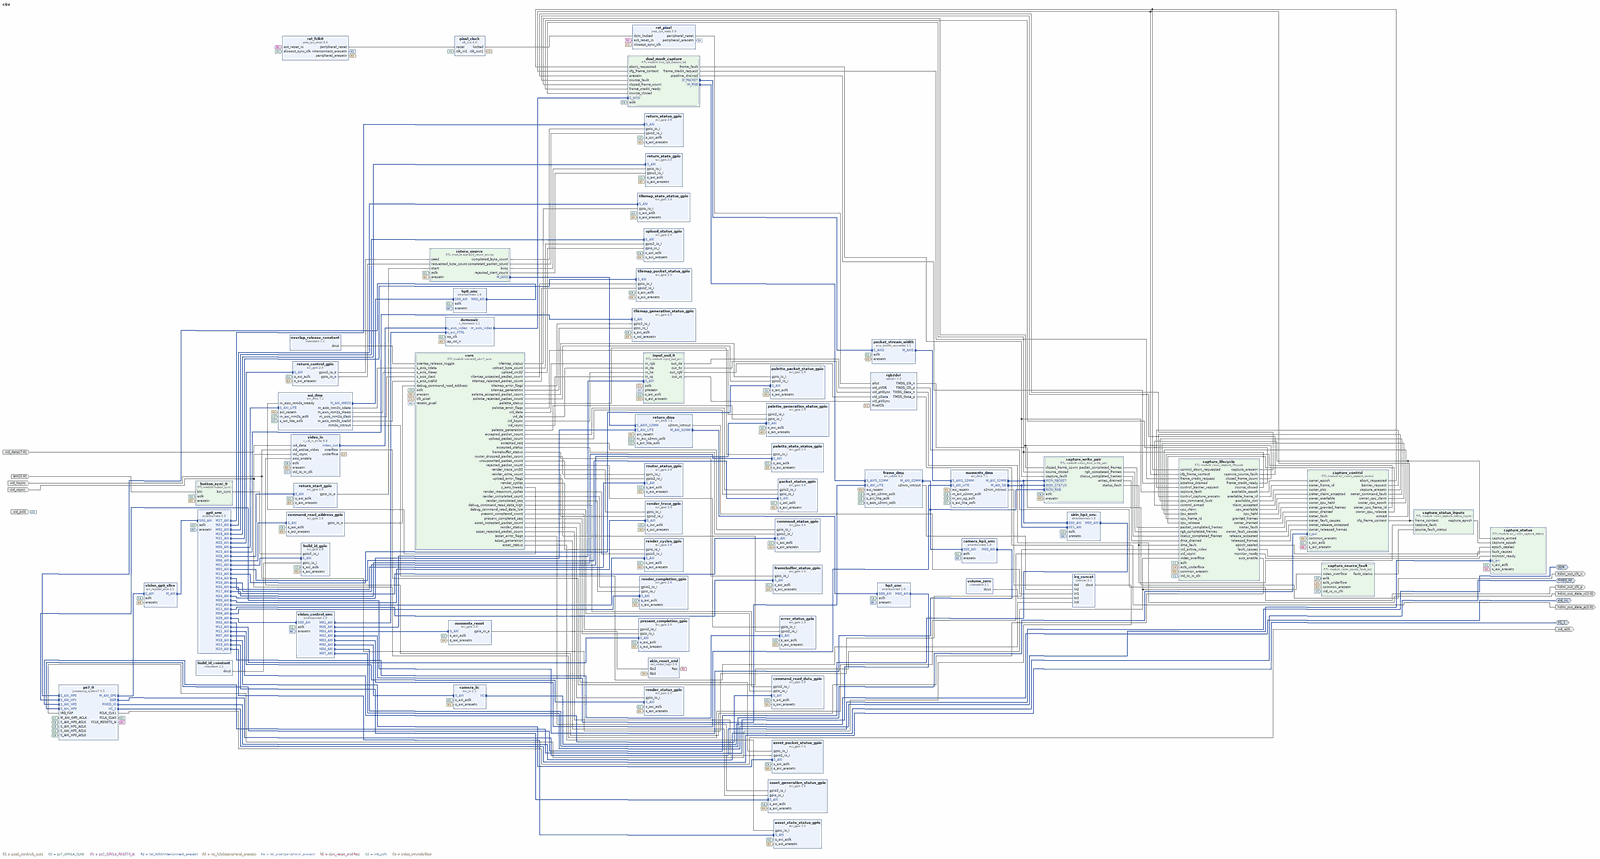
[diagram p0: block diagram of the top level, whole]
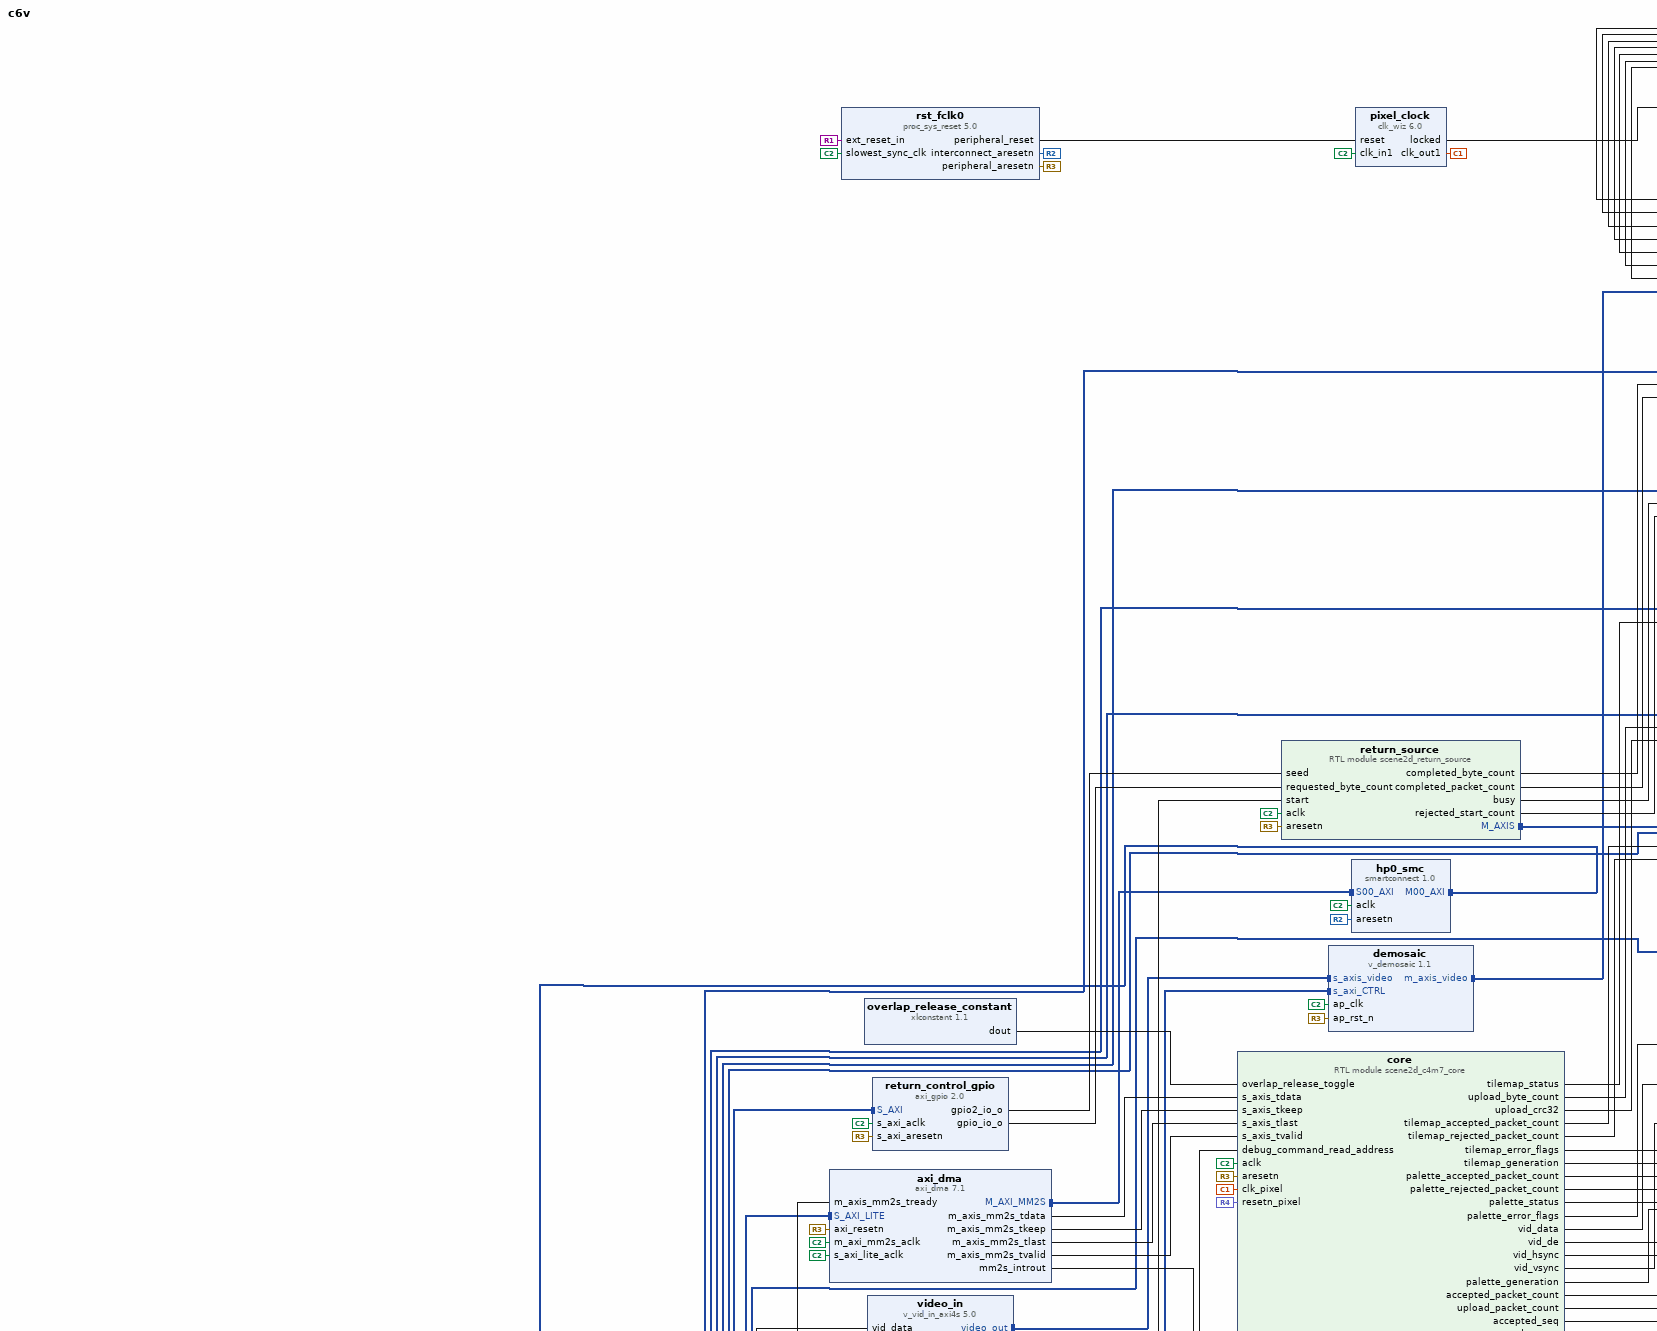
[diagram p1: block diagram of the top level, upper left part]
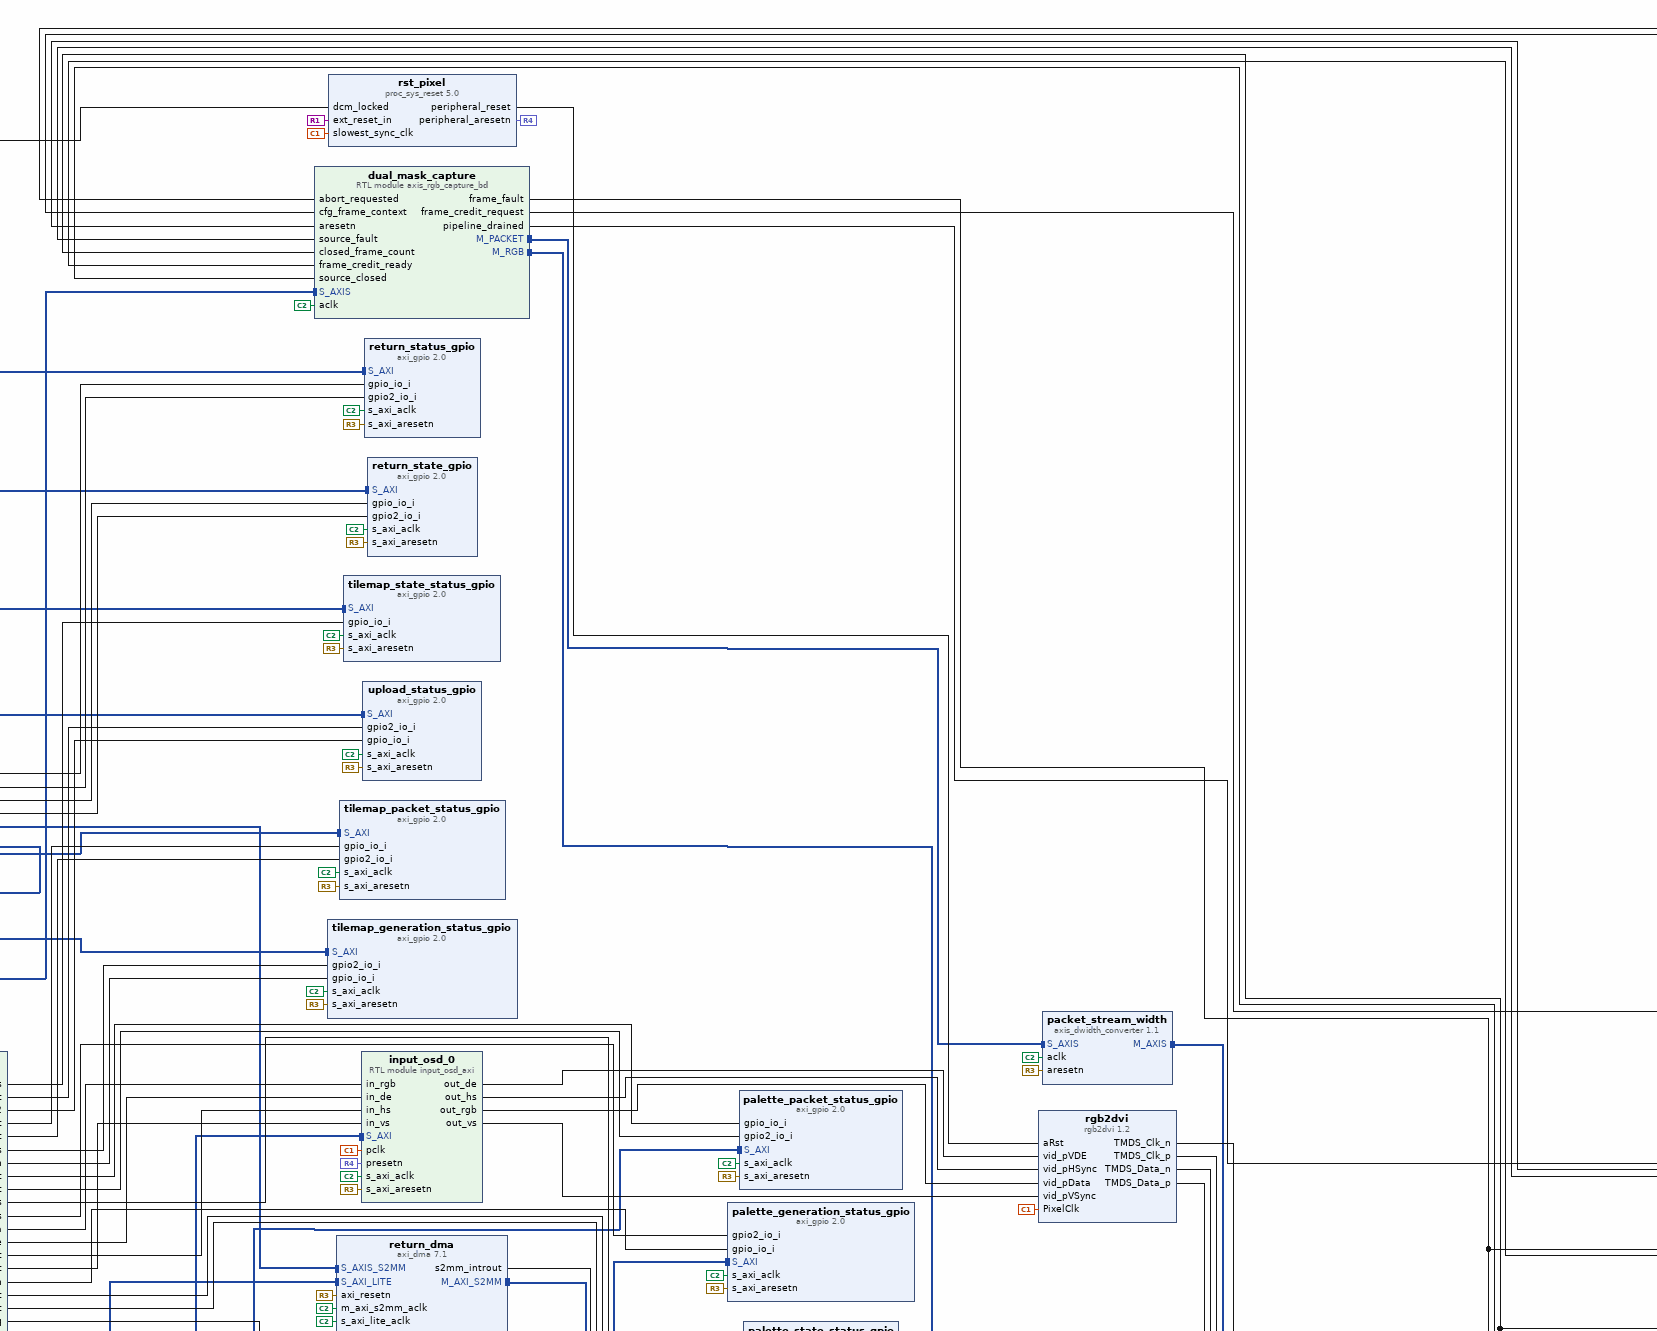
[diagram p2: block diagram of the top level, upper centre part]
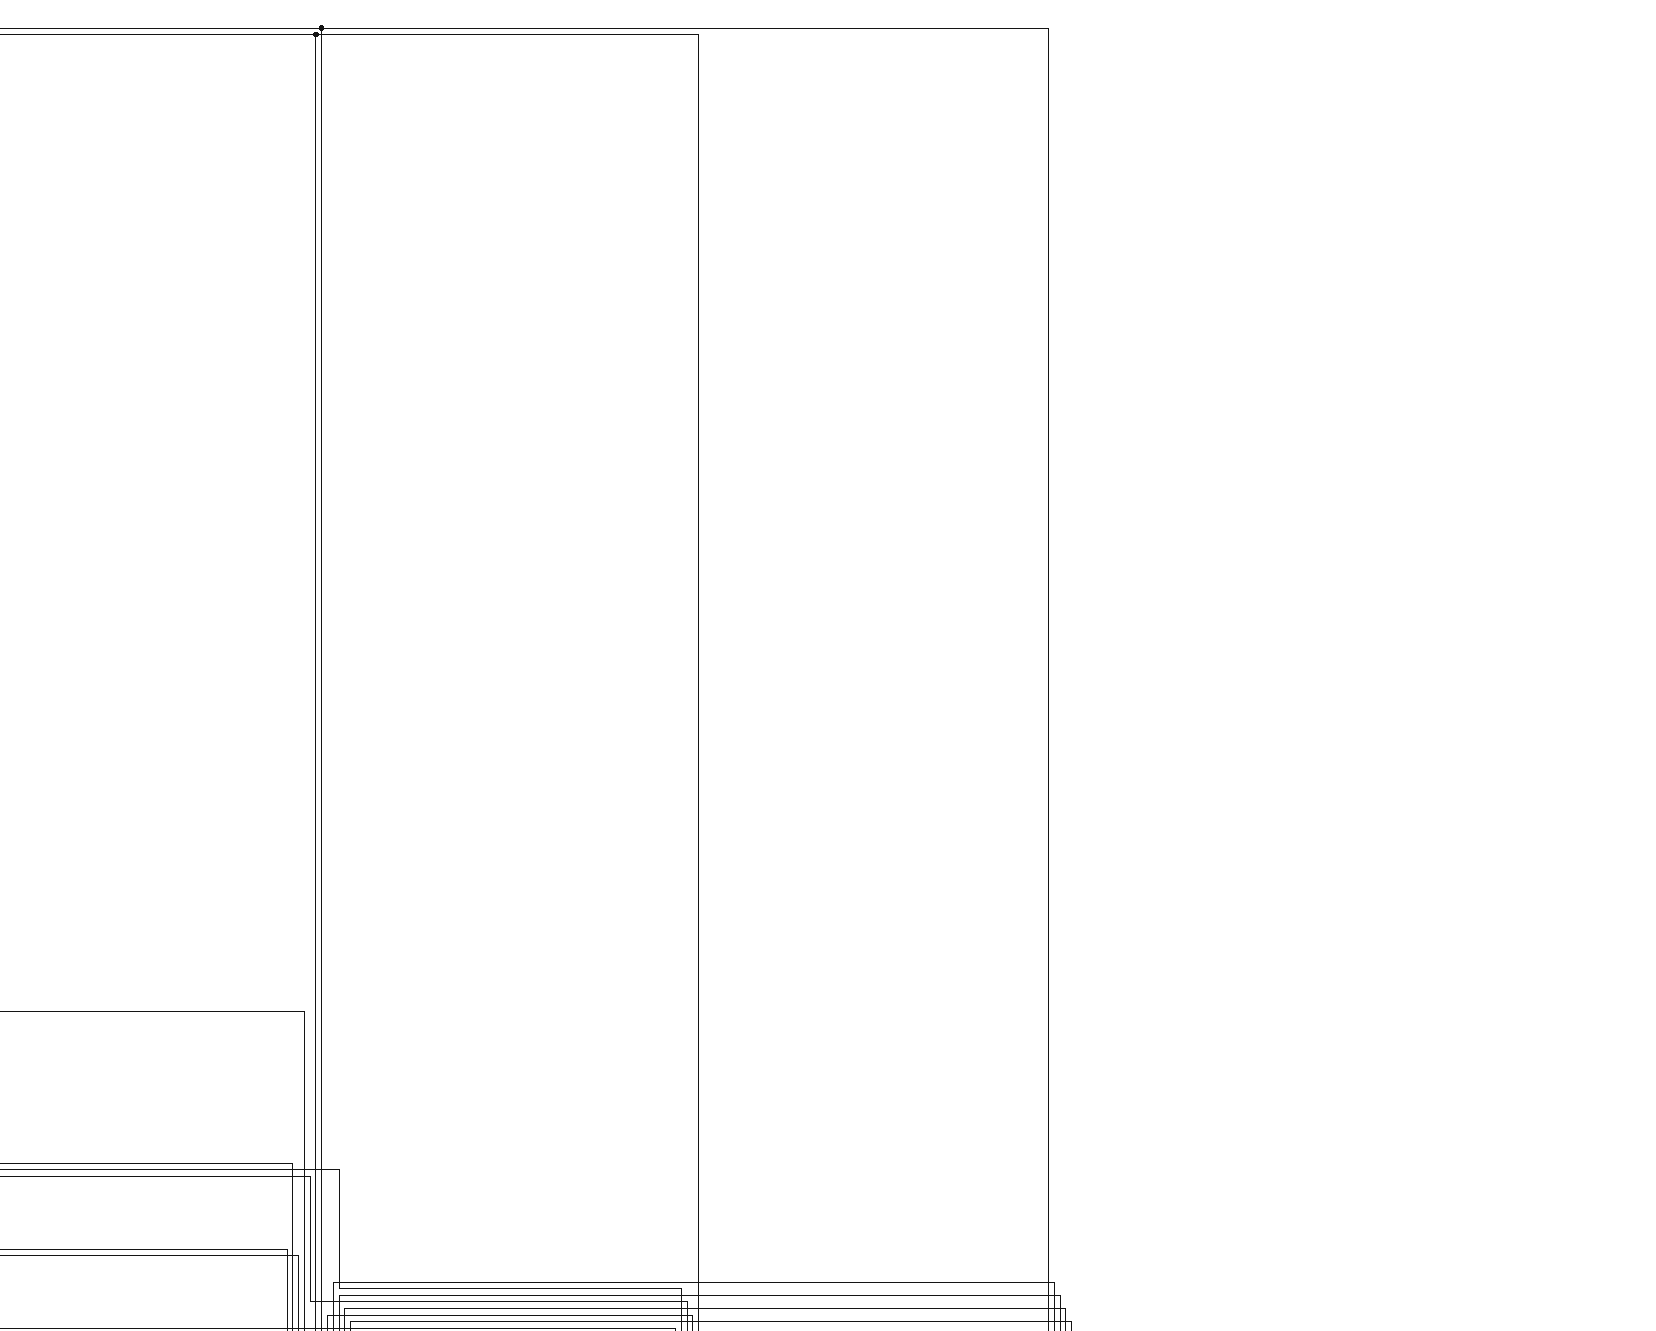
[diagram p3: block diagram of the top level, upper right part]
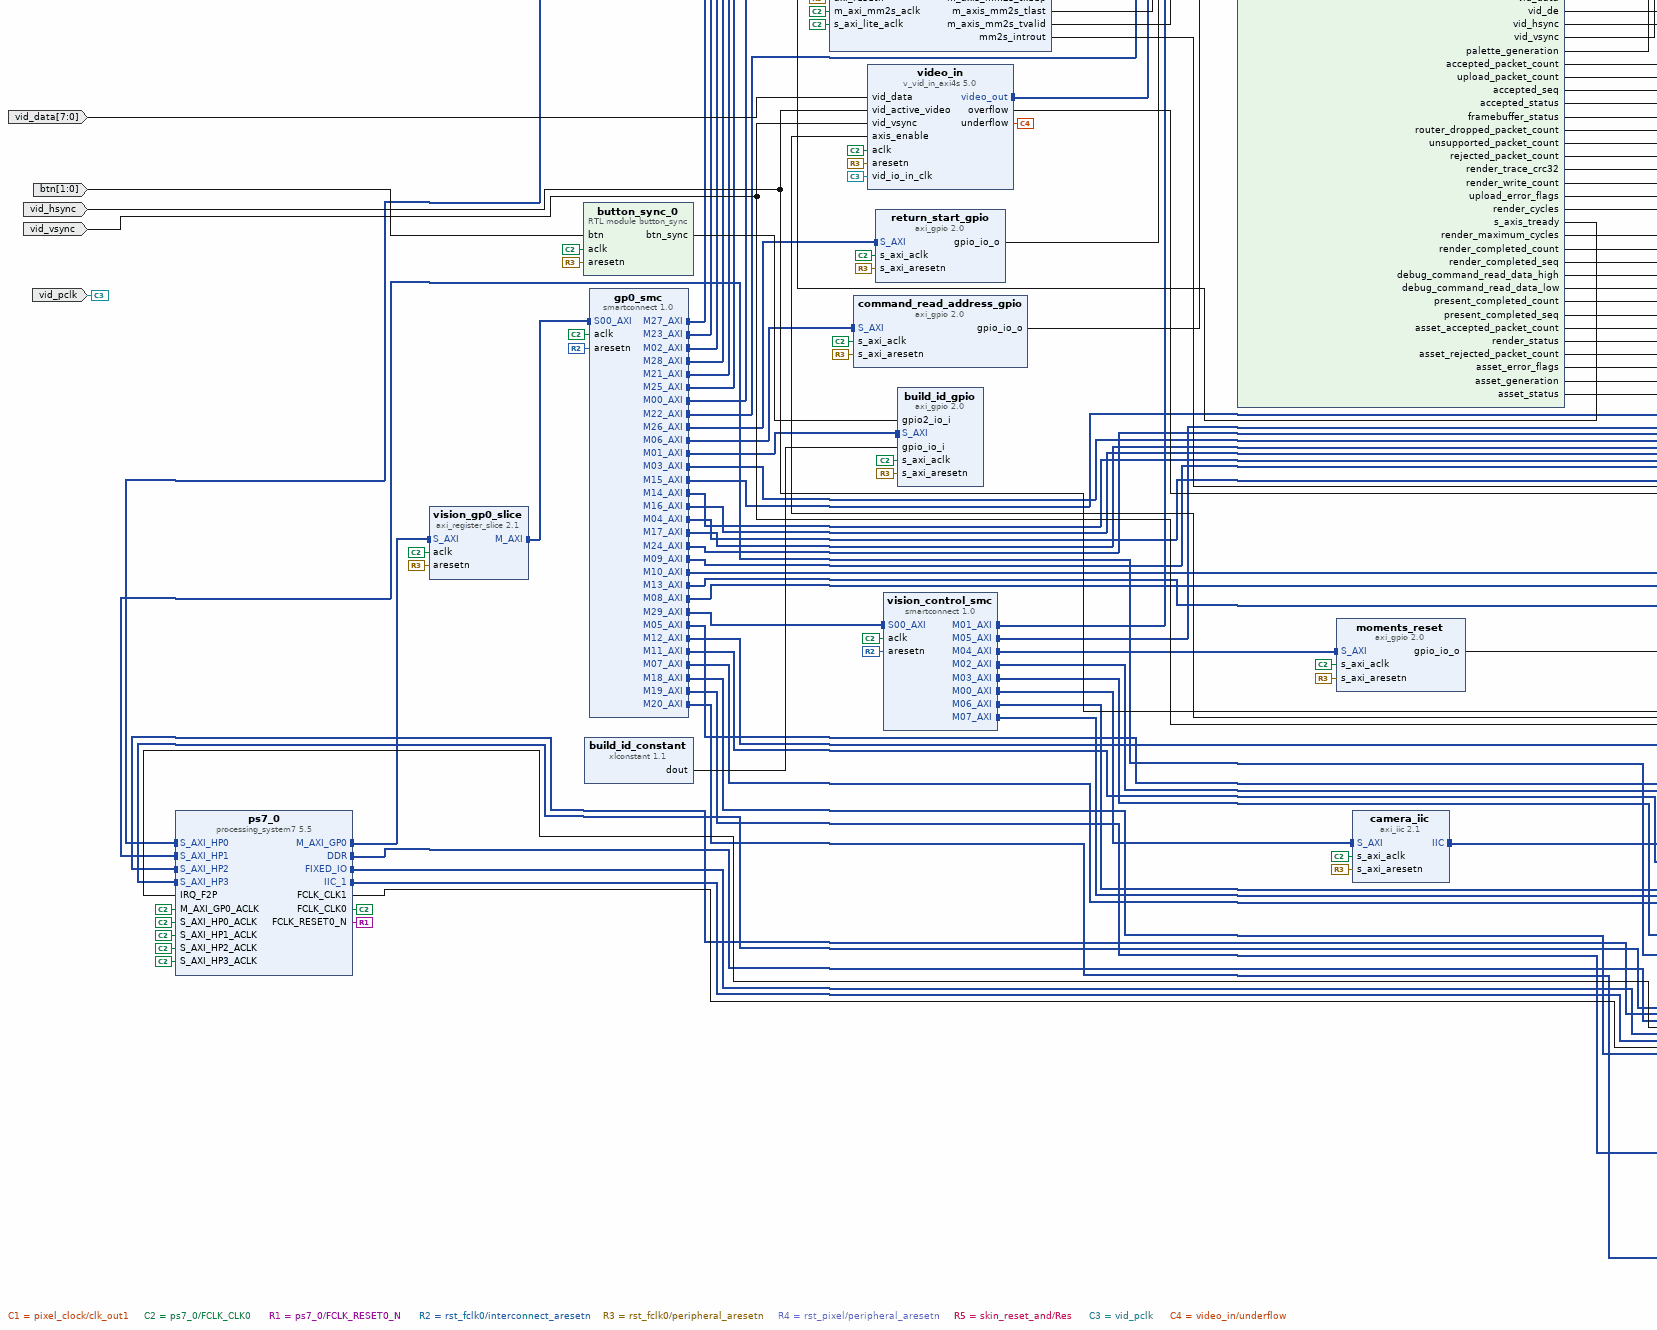
[diagram p4: block diagram of the top level, lower left part]
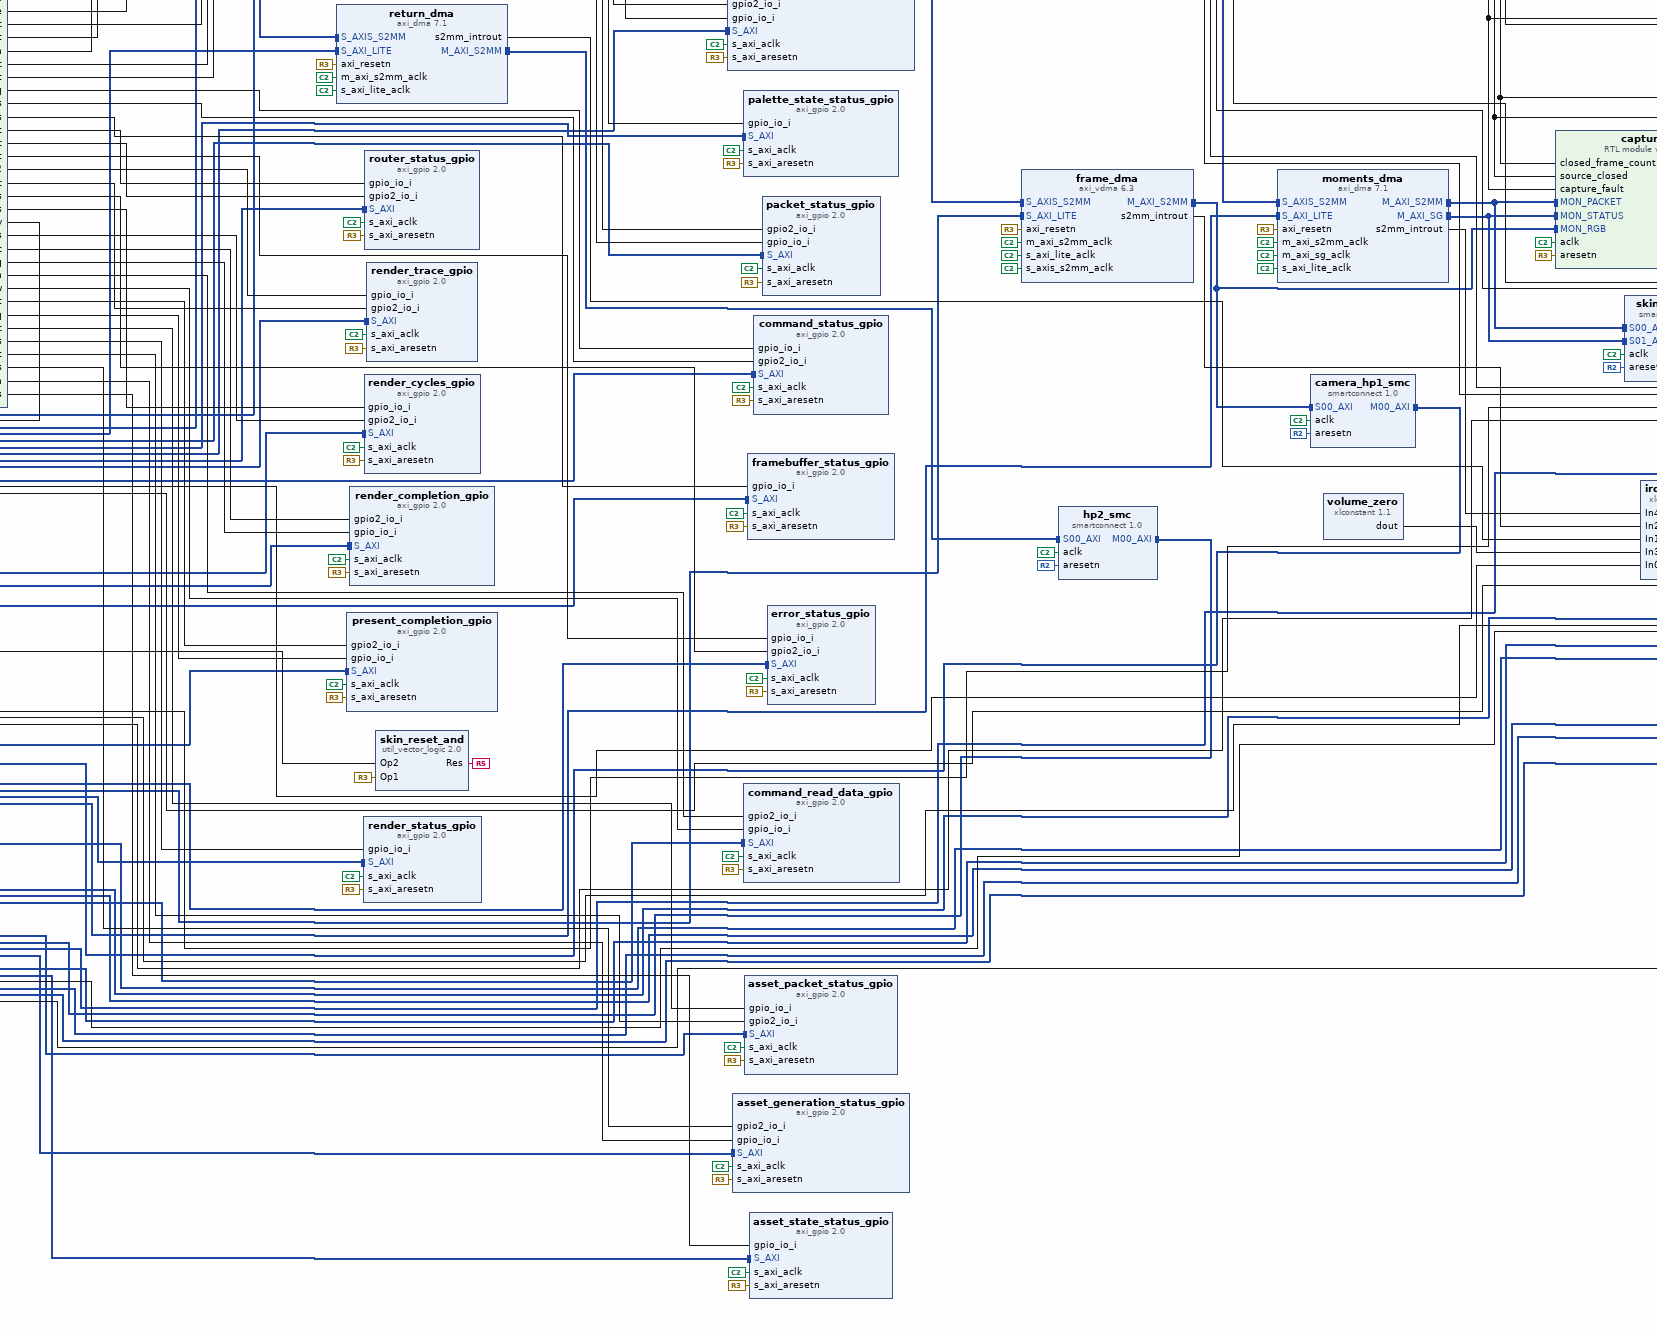
[diagram p5: block diagram of the top level, lower centre part]
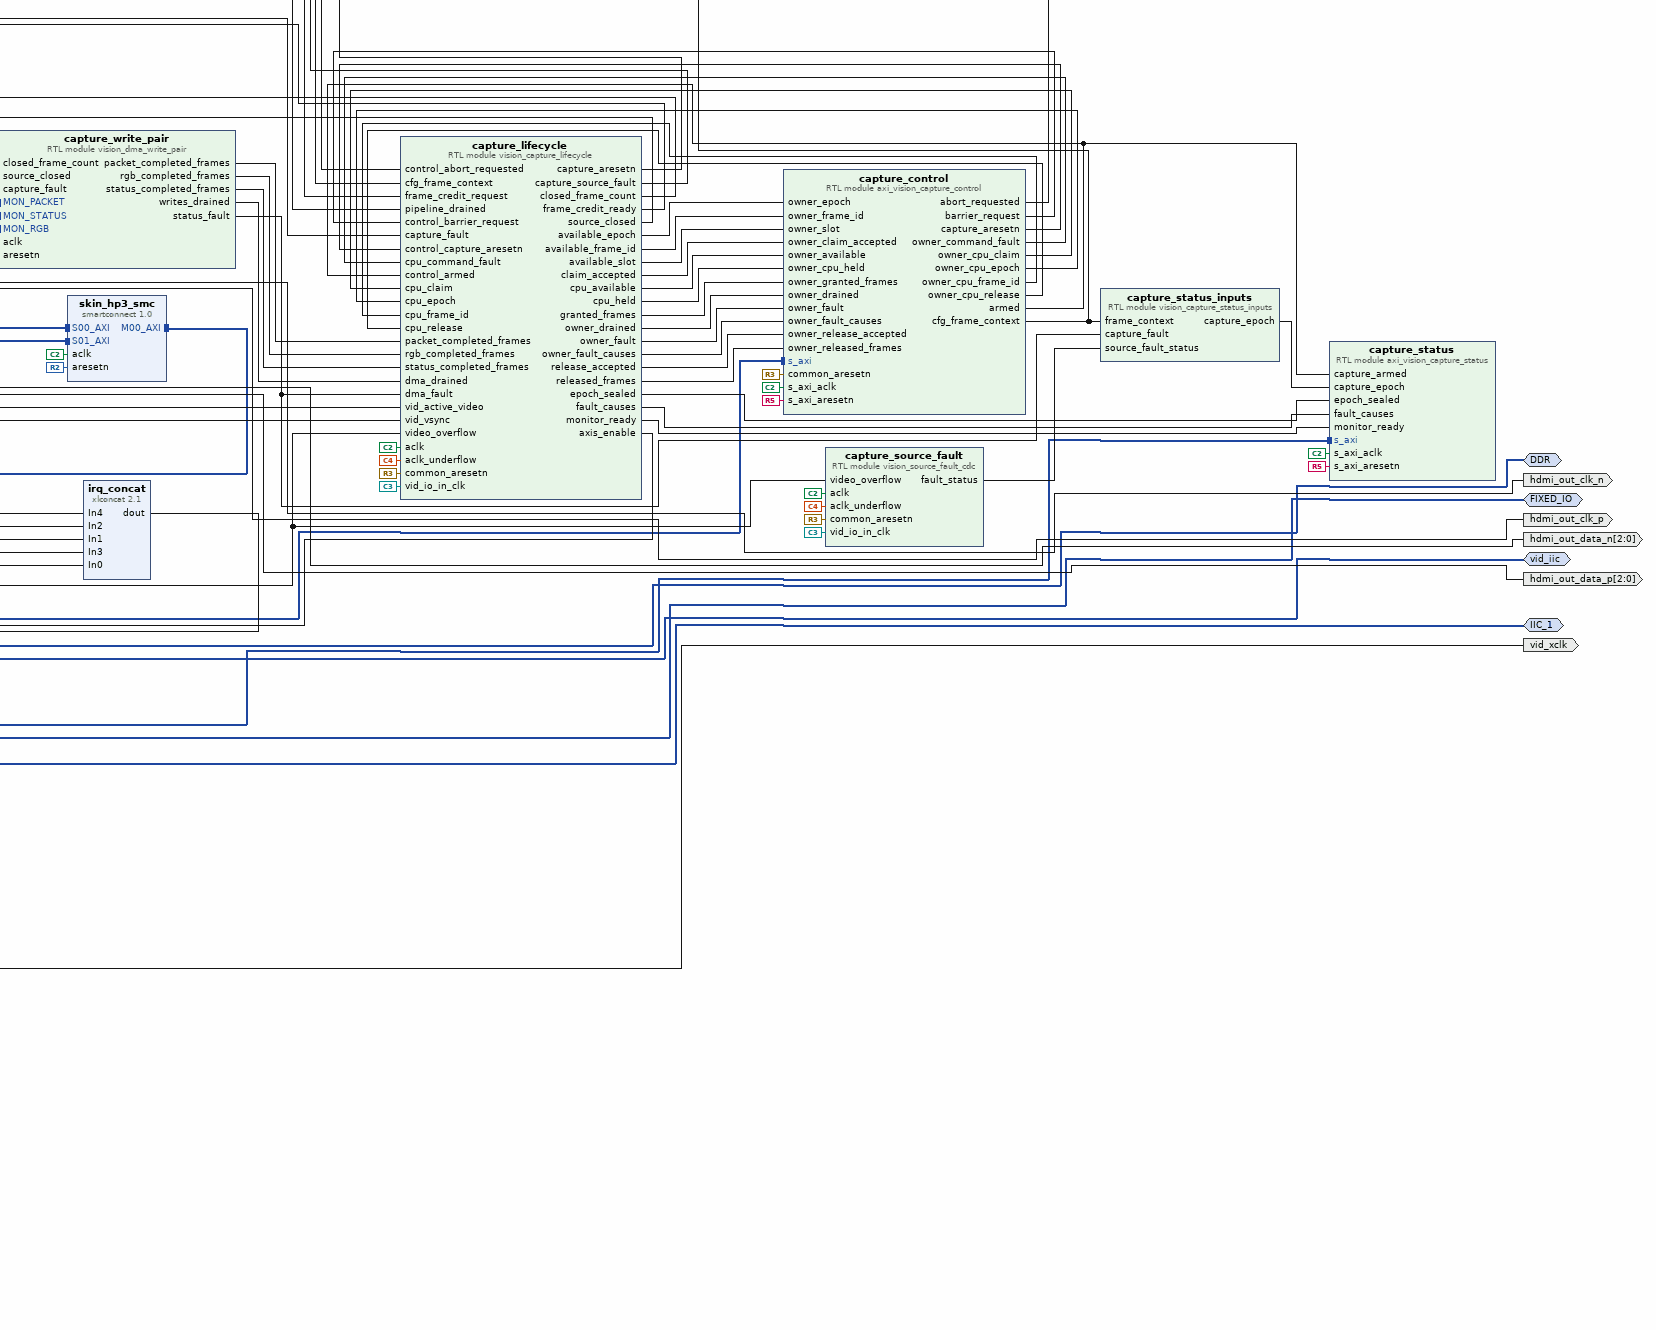
[diagram p6: block diagram of the top level, lower right part]
# Vivado block design c6v, xc7z020clg400-1, Vivado 2026.1
create_bd_design c6v

create_bd_intf_port -mode Master -vlnv xilinx.com:interface:ddrx_rtl:1.0 DDR
create_bd_intf_port -mode Master -vlnv xilinx.com:display_processing_system7:fixedio_rtl:1.0 FIXED_IO
create_bd_intf_port -mode Master -vlnv xilinx.com:interface:iic_rtl:1.0 vid_iic
create_bd_intf_port -mode Master -vlnv xilinx.com:interface:iic_rtl:1.0 IIC_1
create_bd_port -dir O hdmi_out_clk_p
create_bd_port -dir O hdmi_out_clk_n
create_bd_port -dir O -from 2 -to 0 hdmi_out_data_p
create_bd_port -dir O -from 2 -to 0 hdmi_out_data_n
create_bd_port -dir O vid_xclk
create_bd_port -dir I vid_pclk
create_bd_port -dir I vid_vsync
create_bd_port -dir I vid_hsync
create_bd_port -dir I -from 7 -to 0 vid_data
create_bd_port -dir I -from 1 -to 0 btn

create_bd_cell -type ip -vlnv xilinx.com:ip:processing_system7:5.5 ps7_0
set_property -dict [list \
  CONFIG.PCW_APU_PERIPHERAL_FREQMHZ 650 \
  CONFIG.PCW_CRYSTAL_PERIPHERAL_FREQMHZ 50 \
  CONFIG.PCW_ENET0_ENET0_IO {MIO 16 .. 27} \
  CONFIG.PCW_ENET0_GRP_MDIO_ENABLE 1 \
  CONFIG.PCW_ENET0_GRP_MDIO_IO {MIO 52 .. 53} \
  CONFIG.PCW_ENET0_PERIPHERAL_ENABLE 1 \
  CONFIG.PCW_EN_CLK1_PORT 1 \
  CONFIG.PCW_FCLK_CLK1_BUF TRUE \
  CONFIG.PCW_FPGA0_PERIPHERAL_FREQMHZ 100 \
  CONFIG.PCW_FPGA1_PERIPHERAL_FREQMHZ 24.000000 \
  CONFIG.PCW_FPGA2_PERIPHERAL_FREQMHZ 200 \
  CONFIG.PCW_FPGA3_PERIPHERAL_FREQMHZ 100 \
  CONFIG.PCW_FPGA_FCLK1_ENABLE 1 \
  CONFIG.PCW_GPIO_MIO_GPIO_ENABLE 0 \
  CONFIG.PCW_I2C0_GRP_INT_ENABLE 1 \
  CONFIG.PCW_I2C0_GRP_INT_IO EMIO \
  CONFIG.PCW_I2C0_I2C0_IO {MIO 50 .. 51} \
  CONFIG.PCW_I2C0_PERIPHERAL_ENABLE 1 \
  CONFIG.PCW_I2C1_I2C1_IO EMIO \
  CONFIG.PCW_I2C1_PERIPHERAL_ENABLE 1 \
  CONFIG.PCW_I2C_PERIPHERAL_FREQMHZ 108.333336 \
  CONFIG.PCW_IRQ_F2P_INTR 1 \
  CONFIG.PCW_PERIPHERAL_BOARD_PRESET None \
  CONFIG.PCW_PRESET_BANK1_VOLTAGE {LVCMOS 1.8V} \
  CONFIG.PCW_QSPI_GRP_FBCLK_ENABLE 1 \
  CONFIG.PCW_QSPI_GRP_FBCLK_IO {MIO 8} \
  CONFIG.PCW_QSPI_GRP_SINGLE_SS_ENABLE 1 \
  CONFIG.PCW_QSPI_GRP_SINGLE_SS_IO {MIO 1 .. 6} \
  CONFIG.PCW_QSPI_PERIPHERAL_ENABLE 1 \
  CONFIG.PCW_QSPI_QSPI_IO {MIO 1 .. 6} \
  CONFIG.PCW_SD0_GRP_CD_ENABLE 1 \
  CONFIG.PCW_SD0_GRP_CD_IO {MIO 47} \
  CONFIG.PCW_SD0_GRP_WP_ENABLE 0 \
  CONFIG.PCW_SD0_PERIPHERAL_ENABLE 1 \
  CONFIG.PCW_SD0_SD0_IO {MIO 40 .. 45} \
  CONFIG.PCW_SDIO_PERIPHERAL_FREQMHZ 50 \
  CONFIG.PCW_SINGLE_QSPI_DATA_MODE x4 \
  CONFIG.PCW_UART0_PERIPHERAL_ENABLE 1 \
  CONFIG.PCW_UART0_UART0_IO {MIO 14 .. 15} \
  CONFIG.PCW_UART1_PERIPHERAL_ENABLE 0 \
  CONFIG.PCW_UART_PERIPHERAL_FREQMHZ 100 \
  CONFIG.PCW_UIPARAM_DDR_BUS_WIDTH {16 Bit} \
  CONFIG.PCW_UIPARAM_DDR_FREQ_MHZ 525 \
  CONFIG.PCW_UIPARAM_DDR_PARTNO Custom \
  CONFIG.PCW_USB0_PERIPHERAL_ENABLE 1 \
  CONFIG.PCW_USB0_USB0_IO {MIO 28 .. 39} \
  CONFIG.PCW_USE_FABRIC_INTERRUPT 1 \
  CONFIG.PCW_USE_S_AXI_HP0 1 \
  CONFIG.PCW_USE_S_AXI_HP1 1 \
  CONFIG.PCW_USE_S_AXI_HP2 1 \
  CONFIG.PCW_USE_S_AXI_HP3 1 \
] [get_bd_cells ps7_0]
# 482 more settings of ps7_0 are not shown: defaults, MIO pin electricals, DDR timing, and values the tool derives
create_bd_cell -type ip -vlnv xilinx.com:ip:smartconnect:1.0 gp0_smc
set_property -dict {CONFIG.NUM_MI 31 CONFIG.NUM_SI 1} [get_bd_cells gp0_smc]
create_bd_cell -type ip -vlnv xilinx.com:ip:smartconnect:1.0 hp0_smc
set_property -dict {CONFIG.NUM_MI 1 CONFIG.NUM_SI 1} [get_bd_cells hp0_smc]
create_bd_cell -type ip -vlnv xilinx.com:ip:axi_dma:7.1 axi_dma
set_property -dict [list \
  CONFIG.c_include_mm2s 1 \
  CONFIG.c_include_s2mm 0 \
  CONFIG.c_include_sg 0 \
  CONFIG.c_m_axi_mm2s_data_width 64 \
  CONFIG.c_m_axis_mm2s_tdata_width 64 \
  CONFIG.c_mm2s_burst_size 16 \
  CONFIG.c_sg_length_width 26 \
] [get_bd_cells axi_dma]
create_bd_cell -type ip -vlnv xilinx.com:ip:smartconnect:1.0 hp2_smc
set_property -dict {CONFIG.NUM_MI 1 CONFIG.NUM_SI 1} [get_bd_cells hp2_smc]
create_bd_cell -type ip -vlnv xilinx.com:ip:axi_dma:7.1 return_dma
set_property -dict [list \
  CONFIG.c_include_mm2s 0 \
  CONFIG.c_include_s2mm 1 \
  CONFIG.c_include_sg 0 \
  CONFIG.c_m_axi_s2mm_data_width 64 \
  CONFIG.c_s2mm_burst_size 16 \
  CONFIG.c_s_axis_s2mm_tdata_width 64 \
  CONFIG.c_sg_length_width 26 \
] [get_bd_cells return_dma]
create_bd_cell -type ip -vlnv xilinx.com:ip:axi_gpio:2.0 build_id_gpio
set_property -dict [list \
  CONFIG.C_ALL_INPUTS 1 \
  CONFIG.C_ALL_INPUTS_2 1 \
  CONFIG.C_GPIO2_WIDTH 2 \
  CONFIG.C_GPIO_WIDTH 32 \
  CONFIG.C_IS_DUAL 1 \
] [get_bd_cells build_id_gpio]
create_bd_cell -type ip -vlnv xilinx.com:ip:xlconstant:1.1 build_id_constant
set_property -dict {CONFIG.CONST_VAL 0xC0061000 CONFIG.CONST_WIDTH 32} [get_bd_cells build_id_constant]
create_bd_cell -type ip -vlnv xilinx.com:ip:axi_gpio:2.0 upload_status_gpio
set_property -dict [list \
  CONFIG.C_ALL_INPUTS 1 \
  CONFIG.C_ALL_INPUTS_2 1 \
  CONFIG.C_GPIO2_WIDTH 32 \
  CONFIG.C_GPIO_WIDTH 32 \
  CONFIG.C_IS_DUAL 1 \
] [get_bd_cells upload_status_gpio]
create_bd_cell -type ip -vlnv xilinx.com:ip:axi_gpio:2.0 packet_status_gpio
set_property -dict [list \
  CONFIG.C_ALL_INPUTS 1 \
  CONFIG.C_ALL_INPUTS_2 1 \
  CONFIG.C_GPIO2_WIDTH 32 \
  CONFIG.C_GPIO_WIDTH 32 \
  CONFIG.C_IS_DUAL 1 \
] [get_bd_cells packet_status_gpio]
create_bd_cell -type ip -vlnv xilinx.com:ip:axi_gpio:2.0 command_status_gpio
set_property -dict [list \
  CONFIG.C_ALL_INPUTS 1 \
  CONFIG.C_ALL_INPUTS_2 1 \
  CONFIG.C_GPIO2_WIDTH 32 \
  CONFIG.C_GPIO_WIDTH 32 \
  CONFIG.C_IS_DUAL 1 \
] [get_bd_cells command_status_gpio]
create_bd_cell -type ip -vlnv xilinx.com:ip:axi_gpio:2.0 error_status_gpio
set_property -dict [list \
  CONFIG.C_ALL_INPUTS 1 \
  CONFIG.C_ALL_INPUTS_2 1 \
  CONFIG.C_GPIO2_WIDTH 6 \
  CONFIG.C_GPIO_WIDTH 32 \
  CONFIG.C_IS_DUAL 1 \
] [get_bd_cells error_status_gpio]
create_bd_cell -type ip -vlnv xilinx.com:ip:axi_gpio:2.0 command_read_address_gpio
set_property -dict {CONFIG.C_ALL_OUTPUTS 1 CONFIG.C_GPIO_WIDTH 9 CONFIG.C_IS_DUAL 0} [get_bd_cells command_read_address_gpio]
create_bd_cell -type ip -vlnv xilinx.com:ip:axi_gpio:2.0 command_read_data_gpio
set_property -dict [list \
  CONFIG.C_ALL_INPUTS 1 \
  CONFIG.C_ALL_INPUTS_2 1 \
  CONFIG.C_GPIO2_WIDTH 32 \
  CONFIG.C_GPIO_WIDTH 32 \
  CONFIG.C_IS_DUAL 1 \
] [get_bd_cells command_read_data_gpio]
create_bd_cell -type ip -vlnv xilinx.com:ip:axi_gpio:2.0 render_completion_gpio
set_property -dict [list \
  CONFIG.C_ALL_INPUTS 1 \
  CONFIG.C_ALL_INPUTS_2 1 \
  CONFIG.C_GPIO2_WIDTH 32 \
  CONFIG.C_GPIO_WIDTH 32 \
  CONFIG.C_IS_DUAL 1 \
] [get_bd_cells render_completion_gpio]
create_bd_cell -type ip -vlnv xilinx.com:ip:axi_gpio:2.0 render_trace_gpio
set_property -dict [list \
  CONFIG.C_ALL_INPUTS 1 \
  CONFIG.C_ALL_INPUTS_2 1 \
  CONFIG.C_GPIO2_WIDTH 32 \
  CONFIG.C_GPIO_WIDTH 32 \
  CONFIG.C_IS_DUAL 1 \
] [get_bd_cells render_trace_gpio]
create_bd_cell -type ip -vlnv xilinx.com:ip:axi_gpio:2.0 render_cycles_gpio
set_property -dict [list \
  CONFIG.C_ALL_INPUTS 1 \
  CONFIG.C_ALL_INPUTS_2 1 \
  CONFIG.C_GPIO2_WIDTH 32 \
  CONFIG.C_GPIO_WIDTH 32 \
  CONFIG.C_IS_DUAL 1 \
] [get_bd_cells render_cycles_gpio]
create_bd_cell -type ip -vlnv xilinx.com:ip:axi_gpio:2.0 render_status_gpio
set_property -dict {CONFIG.C_ALL_INPUTS 1 CONFIG.C_GPIO_WIDTH 32 CONFIG.C_IS_DUAL 0} [get_bd_cells render_status_gpio]
create_bd_cell -type ip -vlnv xilinx.com:ip:axi_gpio:2.0 present_completion_gpio
set_property -dict [list \
  CONFIG.C_ALL_INPUTS 1 \
  CONFIG.C_ALL_INPUTS_2 1 \
  CONFIG.C_GPIO2_WIDTH 32 \
  CONFIG.C_GPIO_WIDTH 32 \
  CONFIG.C_IS_DUAL 1 \
] [get_bd_cells present_completion_gpio]
create_bd_cell -type ip -vlnv xilinx.com:ip:axi_gpio:2.0 framebuffer_status_gpio
set_property -dict {CONFIG.C_ALL_INPUTS 1 CONFIG.C_GPIO_WIDTH 32 CONFIG.C_IS_DUAL 0} [get_bd_cells framebuffer_status_gpio]
create_bd_cell -type ip -vlnv xilinx.com:ip:axi_gpio:2.0 router_status_gpio
set_property -dict [list \
  CONFIG.C_ALL_INPUTS 1 \
  CONFIG.C_ALL_INPUTS_2 1 \
  CONFIG.C_GPIO2_WIDTH 32 \
  CONFIG.C_GPIO_WIDTH 32 \
  CONFIG.C_IS_DUAL 1 \
] [get_bd_cells router_status_gpio]
create_bd_cell -type ip -vlnv xilinx.com:ip:axi_gpio:2.0 palette_packet_status_gpio
set_property -dict [list \
  CONFIG.C_ALL_INPUTS 1 \
  CONFIG.C_ALL_INPUTS_2 1 \
  CONFIG.C_GPIO2_WIDTH 32 \
  CONFIG.C_GPIO_WIDTH 32 \
  CONFIG.C_IS_DUAL 1 \
] [get_bd_cells palette_packet_status_gpio]
create_bd_cell -type ip -vlnv xilinx.com:ip:axi_gpio:2.0 palette_generation_status_gpio
set_property -dict [list \
  CONFIG.C_ALL_INPUTS 1 \
  CONFIG.C_ALL_INPUTS_2 1 \
  CONFIG.C_GPIO2_WIDTH 9 \
  CONFIG.C_GPIO_WIDTH 32 \
  CONFIG.C_IS_DUAL 1 \
] [get_bd_cells palette_generation_status_gpio]
create_bd_cell -type ip -vlnv xilinx.com:ip:axi_gpio:2.0 palette_state_status_gpio
set_property -dict {CONFIG.C_ALL_INPUTS 1 CONFIG.C_GPIO_WIDTH 32 CONFIG.C_IS_DUAL 0} [get_bd_cells palette_state_status_gpio]
create_bd_cell -type ip -vlnv xilinx.com:ip:axi_gpio:2.0 asset_packet_status_gpio
set_property -dict [list \
  CONFIG.C_ALL_INPUTS 1 \
  CONFIG.C_ALL_INPUTS_2 1 \
  CONFIG.C_GPIO2_WIDTH 32 \
  CONFIG.C_GPIO_WIDTH 32 \
  CONFIG.C_IS_DUAL 1 \
] [get_bd_cells asset_packet_status_gpio]
create_bd_cell -type ip -vlnv xilinx.com:ip:axi_gpio:2.0 asset_generation_status_gpio
set_property -dict [list \
  CONFIG.C_ALL_INPUTS 1 \
  CONFIG.C_ALL_INPUTS_2 1 \
  CONFIG.C_GPIO2_WIDTH 9 \
  CONFIG.C_GPIO_WIDTH 32 \
  CONFIG.C_IS_DUAL 1 \
] [get_bd_cells asset_generation_status_gpio]
create_bd_cell -type ip -vlnv xilinx.com:ip:axi_gpio:2.0 asset_state_status_gpio
set_property -dict {CONFIG.C_ALL_INPUTS 1 CONFIG.C_GPIO_WIDTH 32 CONFIG.C_IS_DUAL 0} [get_bd_cells asset_state_status_gpio]
create_bd_cell -type ip -vlnv xilinx.com:ip:axi_gpio:2.0 tilemap_packet_status_gpio
set_property -dict [list \
  CONFIG.C_ALL_INPUTS 1 \
  CONFIG.C_ALL_INPUTS_2 1 \
  CONFIG.C_GPIO2_WIDTH 32 \
  CONFIG.C_GPIO_WIDTH 32 \
  CONFIG.C_IS_DUAL 1 \
] [get_bd_cells tilemap_packet_status_gpio]
create_bd_cell -type ip -vlnv xilinx.com:ip:axi_gpio:2.0 tilemap_generation_status_gpio
set_property -dict [list \
  CONFIG.C_ALL_INPUTS 1 \
  CONFIG.C_ALL_INPUTS_2 1 \
  CONFIG.C_GPIO2_WIDTH 9 \
  CONFIG.C_GPIO_WIDTH 32 \
  CONFIG.C_IS_DUAL 1 \
] [get_bd_cells tilemap_generation_status_gpio]
create_bd_cell -type ip -vlnv xilinx.com:ip:axi_gpio:2.0 tilemap_state_status_gpio
set_property -dict {CONFIG.C_ALL_INPUTS 1 CONFIG.C_GPIO_WIDTH 32 CONFIG.C_IS_DUAL 0} [get_bd_cells tilemap_state_status_gpio]
create_bd_cell -type ip -vlnv xilinx.com:ip:axi_gpio:2.0 return_control_gpio
set_property -dict [list \
  CONFIG.C_ALL_OUTPUTS 1 \
  CONFIG.C_ALL_OUTPUTS_2 1 \
  CONFIG.C_GPIO2_WIDTH 32 \
  CONFIG.C_GPIO_WIDTH 32 \
  CONFIG.C_IS_DUAL 1 \
] [get_bd_cells return_control_gpio]
create_bd_cell -type ip -vlnv xilinx.com:ip:axi_gpio:2.0 return_start_gpio
set_property -dict {CONFIG.C_ALL_OUTPUTS 1 CONFIG.C_GPIO_WIDTH 1 CONFIG.C_IS_DUAL 0} [get_bd_cells return_start_gpio]
create_bd_cell -type ip -vlnv xilinx.com:ip:axi_gpio:2.0 return_status_gpio
set_property -dict [list \
  CONFIG.C_ALL_INPUTS 1 \
  CONFIG.C_ALL_INPUTS_2 1 \
  CONFIG.C_GPIO2_WIDTH 32 \
  CONFIG.C_GPIO_WIDTH 32 \
  CONFIG.C_IS_DUAL 1 \
] [get_bd_cells return_status_gpio]
create_bd_cell -type ip -vlnv xilinx.com:ip:axi_gpio:2.0 return_state_gpio
set_property -dict [list \
  CONFIG.C_ALL_INPUTS 1 \
  CONFIG.C_ALL_INPUTS_2 1 \
  CONFIG.C_GPIO2_WIDTH 32 \
  CONFIG.C_GPIO_WIDTH 1 \
  CONFIG.C_IS_DUAL 1 \
] [get_bd_cells return_state_gpio]
create_bd_cell -type module -reference scene2d_c4m7_core core
create_bd_cell -type ip -vlnv xilinx.com:ip:xlconstant:1.1 overlap_release_constant
set_property -dict {CONFIG.CONST_VAL 0 CONFIG.CONST_WIDTH 1} [get_bd_cells overlap_release_constant]
create_bd_cell -type ip -vlnv xilinx.com:ip:proc_sys_reset:5.0 rst_fclk0
create_bd_cell -type ip -vlnv xilinx.com:ip:clk_wiz:6.0 pixel_clock
set_property -dict [list \
  CONFIG.CLKOUT1_REQUESTED_OUT_FREQ 74.250 \
  CONFIG.PRIM_IN_FREQ 100.000 \
  CONFIG.PRIM_SOURCE Global_buffer \
  CONFIG.RESET_TYPE ACTIVE_HIGH \
  CONFIG.USE_LOCKED true \
  CONFIG.USE_RESET true \
] [get_bd_cells pixel_clock]
create_bd_cell -type ip -vlnv xilinx.com:ip:proc_sys_reset:5.0 rst_pixel
create_bd_cell -type ip -vlnv digilentinc.com:ip:rgb2dvi:1.2 rgb2dvi
set_property -dict [list \
  CONFIG.kClkPrimitive MMCM \
  CONFIG.kClkRange 2 \
  CONFIG.kGenerateSerialClk true \
  CONFIG.kRstActiveHigh true \
] [get_bd_cells rgb2dvi]
create_bd_cell -type ip -vlnv xilinx.com:ip:xlconcat:2.1 irq_concat
set_property -dict {CONFIG.NUM_PORTS 5} [get_bd_cells irq_concat]
create_bd_cell -type module -reference scene2d_return_source return_source
create_bd_cell -type ip -vlnv xilinx.com:ip:axi_register_slice:2.1 vision_gp0_slice
set_property -dict {CONFIG.REG_AR 1 CONFIG.REG_AW 1 CONFIG.REG_B 1 CONFIG.REG_R 1 CONFIG.REG_W 1} [get_bd_cells vision_gp0_slice]
create_bd_cell -type ip -vlnv xilinx.com:ip:smartconnect:1.0 vision_control_smc
set_property -dict {CONFIG.NUM_MI 8 CONFIG.NUM_SI 1} [get_bd_cells vision_control_smc]
create_bd_cell -type ip -vlnv xilinx.com:ip:smartconnect:1.0 camera_hp1_smc
set_property -dict {CONFIG.NUM_MI 1 CONFIG.NUM_SI 1} [get_bd_cells camera_hp1_smc]
create_bd_cell -type ip -vlnv xilinx.com:ip:smartconnect:1.0 skin_hp3_smc
set_property -dict {CONFIG.NUM_MI 1 CONFIG.NUM_SI 2} [get_bd_cells skin_hp3_smc]
create_bd_cell -type ip -vlnv xilinx.com:ip:axi_iic:2.1 camera_iic
create_bd_cell -type ip -vlnv xilinx.com:ip:v_vid_in_axi4s:5.0 video_in
set_property -dict {CONFIG.C_HAS_ASYNC_CLK 1 CONFIG.C_M_AXIS_VIDEO_FORMAT 12} [get_bd_cells video_in]
create_bd_cell -type ip -vlnv xilinx.com:ip:v_demosaic:1.1 demosaic
create_bd_cell -type ip -vlnv xilinx.com:ip:axi_vdma:6.3 frame_dma
set_property -dict {CONFIG.c_include_mm2s 0 CONFIG.c_include_s2mm 1} [get_bd_cells frame_dma]
create_bd_cell -type ip -vlnv xilinx.com:ip:axi_dma:7.1 moments_dma
set_property -dict [list \
  CONFIG.c_include_mm2s 0 \
  CONFIG.c_include_s2mm 1 \
  CONFIG.c_include_sg 1 \
  CONFIG.c_m_axi_s2mm_data_width 64 \
  CONFIG.c_s2mm_burst_size 16 \
  CONFIG.c_s_axis_s2mm_tdata_width 64 \
  CONFIG.c_sg_include_stscntrl_strm 0 \
  CONFIG.c_sg_length_width 26 \
] [get_bd_cells moments_dma]
create_bd_cell -type ip -vlnv xilinx.com:ip:axi_gpio:2.0 moments_reset
set_property -dict {CONFIG.C_ALL_OUTPUTS 1 CONFIG.C_GPIO_WIDTH 1 CONFIG.C_IS_DUAL 0} [get_bd_cells moments_reset]
create_bd_cell -type ip -vlnv xilinx.com:ip:util_vector_logic:2.0 skin_reset_and
set_property -dict {CONFIG.C_OPERATION and CONFIG.C_SIZE 1} [get_bd_cells skin_reset_and]
create_bd_cell -type ip -vlnv xilinx.com:ip:xlconstant:1.1 volume_zero
set_property -dict {CONFIG.CONST_VAL 0 CONFIG.CONST_WIDTH 1} [get_bd_cells volume_zero]
create_bd_cell -type module -reference input_osd_axi input_osd_0
create_bd_cell -type module -reference axis_rgb_capture_bd dual_mask_capture
set_property -dict {CONFIG.CONTINUOUS 1 CONFIG.SEQUENCE_FRAME_IDS 1 CONFIG.USE_FRAME_CREDITS 1} [get_bd_cells dual_mask_capture]
create_bd_cell -type module -reference axi_vision_capture_control capture_control
set_property -dict {CONFIG.OWNER_PROTOCOL 1} [get_bd_cells capture_control]
create_bd_cell -type module -reference vision_capture_lifecycle capture_lifecycle
create_bd_cell -type module -reference vision_dma_write_pair capture_write_pair
set_property -dict {CONFIG.CONTINUOUS 1 CONFIG.SG_STATUS 1 CONFIG.TRACK_FRAME_COMPLETIONS 1} [get_bd_cells capture_write_pair]
create_bd_cell -type module -reference axi_vision_capture_status capture_status
create_bd_cell -type module -reference vision_source_fault_cdc capture_source_fault
create_bd_cell -type module -reference vision_capture_status_inputs capture_status_inputs
create_bd_cell -type ip -vlnv xilinx.com:ip:axis_dwidth_converter:1.1 packet_stream_width
set_property -dict [list \
  CONFIG.HAS_TKEEP 1 \
  CONFIG.HAS_TLAST 1 \
  CONFIG.M_TDATA_NUM_BYTES 8 \
  CONFIG.S_TDATA_NUM_BYTES 4 \
] [get_bd_cells packet_stream_width]
create_bd_cell -type module -reference button_sync button_sync_0

# ---- connections ----

connect_bd_intf_net [get_bd_intf_pins axi_dma/M_AXI_MM2S] [get_bd_intf_pins hp0_smc/S00_AXI]
connect_bd_intf_net [get_bd_intf_pins camera_hp1_smc/M00_AXI] [get_bd_intf_pins ps7_0/S_AXI_HP1]
connect_bd_intf_net [get_bd_intf_pins camera_iic/IIC] [get_bd_intf_ports vid_iic]
connect_bd_intf_net [get_bd_intf_pins demosaic/m_axis_video] [get_bd_intf_pins dual_mask_capture/S_AXIS]
connect_bd_intf_net [get_bd_intf_pins dual_mask_capture/M_PACKET] [get_bd_intf_pins packet_stream_width/S_AXIS]
connect_bd_intf_net [get_bd_intf_pins dual_mask_capture/M_RGB] [get_bd_intf_pins frame_dma/S_AXIS_S2MM]
connect_bd_intf_net [get_bd_intf_pins frame_dma/M_AXI_S2MM] [get_bd_intf_pins camera_hp1_smc/S00_AXI]
connect_bd_intf_net [get_bd_intf_pins frame_dma/M_AXI_S2MM] [get_bd_intf_pins capture_write_pair/MON_RGB]
connect_bd_intf_net [get_bd_intf_pins gp0_smc/M00_AXI] [get_bd_intf_pins axi_dma/S_AXI_LITE]
connect_bd_intf_net [get_bd_intf_pins gp0_smc/M01_AXI] [get_bd_intf_pins build_id_gpio/S_AXI]
connect_bd_intf_net [get_bd_intf_pins gp0_smc/M02_AXI] [get_bd_intf_pins upload_status_gpio/S_AXI]
connect_bd_intf_net [get_bd_intf_pins gp0_smc/M03_AXI] [get_bd_intf_pins packet_status_gpio/S_AXI]
connect_bd_intf_net [get_bd_intf_pins gp0_smc/M04_AXI] [get_bd_intf_pins command_status_gpio/S_AXI]
connect_bd_intf_net [get_bd_intf_pins gp0_smc/M05_AXI] [get_bd_intf_pins error_status_gpio/S_AXI]
connect_bd_intf_net [get_bd_intf_pins gp0_smc/M06_AXI] [get_bd_intf_pins command_read_address_gpio/S_AXI]
connect_bd_intf_net [get_bd_intf_pins gp0_smc/M07_AXI] [get_bd_intf_pins command_read_data_gpio/S_AXI]
connect_bd_intf_net [get_bd_intf_pins gp0_smc/M08_AXI] [get_bd_intf_pins render_completion_gpio/S_AXI]
connect_bd_intf_net [get_bd_intf_pins gp0_smc/M09_AXI] [get_bd_intf_pins render_trace_gpio/S_AXI]
connect_bd_intf_net [get_bd_intf_pins gp0_smc/M10_AXI] [get_bd_intf_pins render_cycles_gpio/S_AXI]
connect_bd_intf_net [get_bd_intf_pins gp0_smc/M11_AXI] [get_bd_intf_pins render_status_gpio/S_AXI]
connect_bd_intf_net [get_bd_intf_pins gp0_smc/M12_AXI] [get_bd_intf_pins present_completion_gpio/S_AXI]
connect_bd_intf_net [get_bd_intf_pins gp0_smc/M13_AXI] [get_bd_intf_pins framebuffer_status_gpio/S_AXI]
connect_bd_intf_net [get_bd_intf_pins gp0_smc/M14_AXI] [get_bd_intf_pins router_status_gpio/S_AXI]
connect_bd_intf_net [get_bd_intf_pins gp0_smc/M15_AXI] [get_bd_intf_pins palette_packet_status_gpio/S_AXI]
connect_bd_intf_net [get_bd_intf_pins gp0_smc/M16_AXI] [get_bd_intf_pins palette_generation_status_gpio/S_AXI]
connect_bd_intf_net [get_bd_intf_pins gp0_smc/M17_AXI] [get_bd_intf_pins palette_state_status_gpio/S_AXI]
connect_bd_intf_net [get_bd_intf_pins gp0_smc/M18_AXI] [get_bd_intf_pins asset_packet_status_gpio/S_AXI]
connect_bd_intf_net [get_bd_intf_pins gp0_smc/M19_AXI] [get_bd_intf_pins asset_generation_status_gpio/S_AXI]
connect_bd_intf_net [get_bd_intf_pins gp0_smc/M20_AXI] [get_bd_intf_pins asset_state_status_gpio/S_AXI]
connect_bd_intf_net [get_bd_intf_pins gp0_smc/M21_AXI] [get_bd_intf_pins tilemap_packet_status_gpio/S_AXI]
connect_bd_intf_net [get_bd_intf_pins gp0_smc/M22_AXI] [get_bd_intf_pins tilemap_generation_status_gpio/S_AXI]
connect_bd_intf_net [get_bd_intf_pins gp0_smc/M23_AXI] [get_bd_intf_pins tilemap_state_status_gpio/S_AXI]
connect_bd_intf_net [get_bd_intf_pins gp0_smc/M24_AXI] [get_bd_intf_pins return_dma/S_AXI_LITE]
connect_bd_intf_net [get_bd_intf_pins gp0_smc/M25_AXI] [get_bd_intf_pins return_control_gpio/S_AXI]
connect_bd_intf_net [get_bd_intf_pins gp0_smc/M26_AXI] [get_bd_intf_pins return_start_gpio/S_AXI]
connect_bd_intf_net [get_bd_intf_pins gp0_smc/M27_AXI] [get_bd_intf_pins return_status_gpio/S_AXI]
connect_bd_intf_net [get_bd_intf_pins gp0_smc/M28_AXI] [get_bd_intf_pins return_state_gpio/S_AXI]
connect_bd_intf_net [get_bd_intf_pins gp0_smc/M29_AXI] [get_bd_intf_pins vision_control_smc/S00_AXI]
connect_bd_intf_net [get_bd_intf_pins hp0_smc/M00_AXI] [get_bd_intf_pins ps7_0/S_AXI_HP0]
connect_bd_intf_net [get_bd_intf_pins hp2_smc/M00_AXI] [get_bd_intf_pins ps7_0/S_AXI_HP2]
connect_bd_intf_net [get_bd_intf_pins moments_dma/M_AXI_S2MM] [get_bd_intf_pins skin_hp3_smc/S00_AXI]
connect_bd_intf_net [get_bd_intf_pins moments_dma/M_AXI_S2MM] [get_bd_intf_pins capture_write_pair/MON_PACKET]
connect_bd_intf_net [get_bd_intf_pins moments_dma/M_AXI_SG] [get_bd_intf_pins skin_hp3_smc/S01_AXI]
connect_bd_intf_net [get_bd_intf_pins moments_dma/M_AXI_SG] [get_bd_intf_pins capture_write_pair/MON_STATUS]
connect_bd_intf_net [get_bd_intf_pins packet_stream_width/M_AXIS] [get_bd_intf_pins moments_dma/S_AXIS_S2MM]
connect_bd_intf_net [get_bd_intf_pins ps7_0/DDR] [get_bd_intf_ports DDR]
connect_bd_intf_net [get_bd_intf_pins ps7_0/FIXED_IO] [get_bd_intf_ports FIXED_IO]
connect_bd_intf_net [get_bd_intf_ports IIC_1] [get_bd_intf_pins ps7_0/IIC_1]
connect_bd_intf_net [get_bd_intf_pins ps7_0/M_AXI_GP0] [get_bd_intf_pins vision_gp0_slice/S_AXI]
connect_bd_intf_net [get_bd_intf_pins return_dma/M_AXI_S2MM] [get_bd_intf_pins hp2_smc/S00_AXI]
connect_bd_intf_net [get_bd_intf_pins return_source/M_AXIS] [get_bd_intf_pins return_dma/S_AXIS_S2MM]
connect_bd_intf_net [get_bd_intf_pins skin_hp3_smc/M00_AXI] [get_bd_intf_pins ps7_0/S_AXI_HP3]
connect_bd_intf_net [get_bd_intf_pins video_in/video_out] [get_bd_intf_pins demosaic/s_axis_video]
connect_bd_intf_net [get_bd_intf_pins vision_control_smc/M00_AXI] [get_bd_intf_pins camera_iic/S_AXI]
connect_bd_intf_net [get_bd_intf_pins vision_control_smc/M01_AXI] [get_bd_intf_pins demosaic/s_axi_CTRL]
connect_bd_intf_net [get_bd_intf_pins vision_control_smc/M02_AXI] [get_bd_intf_pins frame_dma/S_AXI_LITE]
connect_bd_intf_net [get_bd_intf_pins vision_control_smc/M03_AXI] [get_bd_intf_pins moments_dma/S_AXI_LITE]
connect_bd_intf_net [get_bd_intf_pins vision_control_smc/M04_AXI] [get_bd_intf_pins moments_reset/S_AXI]
connect_bd_intf_net [get_bd_intf_pins vision_control_smc/M05_AXI] [get_bd_intf_pins input_osd_0/S_AXI]
connect_bd_intf_net [get_bd_intf_pins vision_control_smc/M06_AXI] [get_bd_intf_pins capture_control/s_axi]
connect_bd_intf_net [get_bd_intf_pins vision_control_smc/M07_AXI] [get_bd_intf_pins capture_status/s_axi]
connect_bd_intf_net [get_bd_intf_pins vision_gp0_slice/M_AXI] [get_bd_intf_pins gp0_smc/S00_AXI]
connect_bd_net [get_bd_pins axi_dma/m_axis_mm2s_tdata] [get_bd_pins core/s_axis_tdata]
connect_bd_net [get_bd_pins axi_dma/m_axis_mm2s_tkeep] [get_bd_pins core/s_axis_tkeep]
connect_bd_net [get_bd_pins axi_dma/m_axis_mm2s_tlast] [get_bd_pins core/s_axis_tlast]
connect_bd_net [get_bd_pins axi_dma/m_axis_mm2s_tvalid] [get_bd_pins core/s_axis_tvalid]
connect_bd_net [get_bd_pins axi_dma/mm2s_introut] [get_bd_pins irq_concat/In0]
connect_bd_net [get_bd_ports btn] [get_bd_pins button_sync_0/btn]
connect_bd_net [get_bd_pins build_id_constant/dout] [get_bd_pins build_id_gpio/gpio_io_i]
connect_bd_net [get_bd_pins button_sync_0/btn_sync] [get_bd_pins build_id_gpio/gpio2_io_i]
connect_bd_net [get_bd_pins capture_control/abort_requested] \
  [get_bd_pins dual_mask_capture/abort_requested] [get_bd_pins capture_lifecycle/control_abort_requested]
connect_bd_net [get_bd_pins capture_control/armed] [get_bd_pins capture_status/capture_armed] [get_bd_pins capture_lifecycle/control_armed]
connect_bd_net [get_bd_pins capture_control/barrier_request] [get_bd_pins capture_lifecycle/control_barrier_request]
connect_bd_net [get_bd_pins capture_control/capture_aresetn] [get_bd_pins capture_lifecycle/control_capture_aresetn]
connect_bd_net [get_bd_pins capture_control/cfg_frame_context] \
  [get_bd_pins capture_status_inputs/frame_context] [get_bd_pins dual_mask_capture/cfg_frame_context] \
  [get_bd_pins capture_lifecycle/cfg_frame_context]
connect_bd_net [get_bd_pins capture_control/owner_command_fault] [get_bd_pins capture_lifecycle/cpu_command_fault]
connect_bd_net [get_bd_pins capture_control/owner_cpu_claim] [get_bd_pins capture_lifecycle/cpu_claim]
connect_bd_net [get_bd_pins capture_control/owner_cpu_epoch] [get_bd_pins capture_lifecycle/cpu_epoch]
connect_bd_net [get_bd_pins capture_control/owner_cpu_frame_id] [get_bd_pins capture_lifecycle/cpu_frame_id]
connect_bd_net [get_bd_pins capture_control/owner_cpu_release] [get_bd_pins capture_lifecycle/cpu_release]
connect_bd_net [get_bd_pins capture_lifecycle/available_epoch] [get_bd_pins capture_control/owner_epoch]
connect_bd_net [get_bd_pins capture_lifecycle/available_frame_id] [get_bd_pins capture_control/owner_frame_id]
connect_bd_net [get_bd_pins capture_lifecycle/available_slot] [get_bd_pins capture_control/owner_slot]
connect_bd_net [get_bd_pins capture_lifecycle/axis_enable] [get_bd_pins video_in/axis_enable]
connect_bd_net [get_bd_pins capture_lifecycle/capture_aresetn] [get_bd_pins dual_mask_capture/aresetn]
connect_bd_net [get_bd_pins capture_lifecycle/capture_source_fault] [get_bd_pins dual_mask_capture/source_fault]
connect_bd_net [get_bd_pins capture_lifecycle/claim_accepted] [get_bd_pins capture_control/owner_claim_accepted]
connect_bd_net [get_bd_pins capture_lifecycle/closed_frame_count] \
  [get_bd_pins capture_write_pair/closed_frame_count] [get_bd_pins dual_mask_capture/closed_frame_count]
connect_bd_net [get_bd_pins capture_lifecycle/cpu_available] [get_bd_pins capture_control/owner_available]
connect_bd_net [get_bd_pins capture_lifecycle/cpu_held] [get_bd_pins capture_control/owner_cpu_held]
connect_bd_net [get_bd_pins capture_lifecycle/epoch_sealed] [get_bd_pins capture_status/epoch_sealed]
connect_bd_net [get_bd_pins capture_lifecycle/fault_causes] [get_bd_pins capture_status/fault_causes]
connect_bd_net [get_bd_pins capture_lifecycle/frame_credit_ready] [get_bd_pins dual_mask_capture/frame_credit_ready]
connect_bd_net [get_bd_pins capture_lifecycle/granted_frames] [get_bd_pins capture_control/owner_granted_frames]
connect_bd_net [get_bd_pins capture_lifecycle/monitor_ready] [get_bd_pins capture_status/monitor_ready]
connect_bd_net [get_bd_pins capture_lifecycle/owner_drained] [get_bd_pins capture_control/owner_drained]
connect_bd_net [get_bd_pins capture_lifecycle/owner_fault] [get_bd_pins capture_control/owner_fault]
connect_bd_net [get_bd_pins capture_lifecycle/owner_fault_causes] [get_bd_pins capture_control/owner_fault_causes]
connect_bd_net [get_bd_pins capture_lifecycle/release_accepted] [get_bd_pins capture_control/owner_release_accepted]
connect_bd_net [get_bd_pins capture_lifecycle/released_frames] [get_bd_pins capture_control/owner_released_frames]
connect_bd_net [get_bd_pins capture_lifecycle/source_closed] \
  [get_bd_pins capture_write_pair/source_closed] [get_bd_pins dual_mask_capture/source_closed]
connect_bd_net [get_bd_pins capture_source_fault/fault_status] [get_bd_pins capture_status_inputs/source_fault_status]
connect_bd_net [get_bd_pins capture_status_inputs/capture_epoch] [get_bd_pins capture_status/capture_epoch]
connect_bd_net [get_bd_pins capture_write_pair/packet_completed_frames] [get_bd_pins capture_lifecycle/packet_completed_frames]
connect_bd_net [get_bd_pins capture_write_pair/rgb_completed_frames] [get_bd_pins capture_lifecycle/rgb_completed_frames]
connect_bd_net [get_bd_pins capture_write_pair/status_completed_frames] [get_bd_pins capture_lifecycle/status_completed_frames]
connect_bd_net [get_bd_pins capture_write_pair/status_fault] \
  [get_bd_pins capture_status_inputs/capture_fault] [get_bd_pins capture_lifecycle/dma_fault]
connect_bd_net [get_bd_pins capture_write_pair/writes_drained] [get_bd_pins capture_lifecycle/dma_drained]
connect_bd_net [get_bd_pins command_read_address_gpio/gpio_io_o] [get_bd_pins core/debug_command_read_address]
connect_bd_net [get_bd_pins core/accepted_packet_count] [get_bd_pins packet_status_gpio/gpio2_io_i]
connect_bd_net [get_bd_pins core/accepted_seq] [get_bd_pins command_status_gpio/gpio_io_i]
connect_bd_net [get_bd_pins core/accepted_status] [get_bd_pins command_status_gpio/gpio2_io_i]
connect_bd_net [get_bd_pins core/asset_accepted_packet_count] [get_bd_pins asset_packet_status_gpio/gpio_io_i]
connect_bd_net [get_bd_pins core/asset_error_flags] [get_bd_pins asset_generation_status_gpio/gpio2_io_i]
connect_bd_net [get_bd_pins core/asset_generation] [get_bd_pins asset_generation_status_gpio/gpio_io_i]
connect_bd_net [get_bd_pins core/asset_rejected_packet_count] [get_bd_pins asset_packet_status_gpio/gpio2_io_i]
connect_bd_net [get_bd_pins core/asset_status] [get_bd_pins asset_state_status_gpio/gpio_io_i]
connect_bd_net [get_bd_pins core/debug_command_read_data_high] [get_bd_pins command_read_data_gpio/gpio2_io_i]
connect_bd_net [get_bd_pins core/debug_command_read_data_low] [get_bd_pins command_read_data_gpio/gpio_io_i]
connect_bd_net [get_bd_pins core/framebuffer_status] [get_bd_pins framebuffer_status_gpio/gpio_io_i]
connect_bd_net [get_bd_pins core/palette_accepted_packet_count] [get_bd_pins palette_packet_status_gpio/gpio_io_i]
connect_bd_net [get_bd_pins core/palette_error_flags] [get_bd_pins palette_generation_status_gpio/gpio2_io_i]
connect_bd_net [get_bd_pins core/palette_generation] [get_bd_pins palette_generation_status_gpio/gpio_io_i]
connect_bd_net [get_bd_pins core/palette_rejected_packet_count] [get_bd_pins palette_packet_status_gpio/gpio2_io_i]
connect_bd_net [get_bd_pins core/palette_status] [get_bd_pins palette_state_status_gpio/gpio_io_i]
connect_bd_net [get_bd_pins core/present_completed_count] [get_bd_pins present_completion_gpio/gpio2_io_i]
connect_bd_net [get_bd_pins core/present_completed_seq] [get_bd_pins present_completion_gpio/gpio_io_i]
connect_bd_net [get_bd_pins core/rejected_packet_count] [get_bd_pins error_status_gpio/gpio_io_i]
connect_bd_net [get_bd_pins core/render_completed_count] [get_bd_pins render_completion_gpio/gpio2_io_i]
connect_bd_net [get_bd_pins core/render_completed_seq] [get_bd_pins render_completion_gpio/gpio_io_i]
connect_bd_net [get_bd_pins core/render_cycles] [get_bd_pins render_cycles_gpio/gpio_io_i]
connect_bd_net [get_bd_pins core/render_maximum_cycles] [get_bd_pins render_cycles_gpio/gpio2_io_i]
connect_bd_net [get_bd_pins core/render_status] [get_bd_pins render_status_gpio/gpio_io_i]
connect_bd_net [get_bd_pins core/render_trace_crc32] [get_bd_pins render_trace_gpio/gpio_io_i]
connect_bd_net [get_bd_pins core/render_write_count] [get_bd_pins render_trace_gpio/gpio2_io_i]
connect_bd_net [get_bd_pins core/router_dropped_packet_count] [get_bd_pins router_status_gpio/gpio_io_i]
connect_bd_net [get_bd_pins core/s_axis_tready] [get_bd_pins axi_dma/m_axis_mm2s_tready]
connect_bd_net [get_bd_pins core/tilemap_accepted_packet_count] [get_bd_pins tilemap_packet_status_gpio/gpio_io_i]
connect_bd_net [get_bd_pins core/tilemap_error_flags] [get_bd_pins tilemap_generation_status_gpio/gpio2_io_i]
connect_bd_net [get_bd_pins core/tilemap_generation] [get_bd_pins tilemap_generation_status_gpio/gpio_io_i]
connect_bd_net [get_bd_pins core/tilemap_rejected_packet_count] [get_bd_pins tilemap_packet_status_gpio/gpio2_io_i]
connect_bd_net [get_bd_pins core/tilemap_status] [get_bd_pins tilemap_state_status_gpio/gpio_io_i]
connect_bd_net [get_bd_pins core/unsupported_packet_count] [get_bd_pins router_status_gpio/gpio2_io_i]
connect_bd_net [get_bd_pins core/upload_byte_count] [get_bd_pins upload_status_gpio/gpio2_io_i]
connect_bd_net [get_bd_pins core/upload_crc32] [get_bd_pins upload_status_gpio/gpio_io_i]
connect_bd_net [get_bd_pins core/upload_error_flags] [get_bd_pins error_status_gpio/gpio2_io_i]
connect_bd_net [get_bd_pins core/upload_packet_count] [get_bd_pins packet_status_gpio/gpio_io_i]
connect_bd_net [get_bd_pins core/vid_data] [get_bd_pins input_osd_0/in_rgb]
connect_bd_net [get_bd_pins core/vid_de] [get_bd_pins input_osd_0/in_de]
connect_bd_net [get_bd_pins core/vid_hsync] [get_bd_pins input_osd_0/in_hs]
connect_bd_net [get_bd_pins core/vid_vsync] [get_bd_pins input_osd_0/in_vs]
connect_bd_net [get_bd_pins dual_mask_capture/frame_credit_request] [get_bd_pins capture_lifecycle/frame_credit_request]
connect_bd_net [get_bd_pins dual_mask_capture/frame_fault] \
  [get_bd_pins capture_write_pair/capture_fault] [get_bd_pins capture_lifecycle/capture_fault]
connect_bd_net [get_bd_pins dual_mask_capture/pipeline_drained] [get_bd_pins capture_lifecycle/pipeline_drained]
connect_bd_net [get_bd_pins frame_dma/s2mm_introut] [get_bd_pins irq_concat/In2]
connect_bd_net [get_bd_pins input_osd_0/out_de] [get_bd_pins rgb2dvi/vid_pVDE]
connect_bd_net [get_bd_pins input_osd_0/out_hs] [get_bd_pins rgb2dvi/vid_pHSync]
connect_bd_net [get_bd_pins input_osd_0/out_rgb] [get_bd_pins rgb2dvi/vid_pData]
connect_bd_net [get_bd_pins input_osd_0/out_vs] [get_bd_pins rgb2dvi/vid_pVSync]
connect_bd_net [get_bd_pins irq_concat/dout] [get_bd_pins ps7_0/IRQ_F2P]
connect_bd_net [get_bd_pins moments_dma/s2mm_introut] [get_bd_pins irq_concat/In4]
connect_bd_net [get_bd_pins moments_reset/gpio_io_o] [get_bd_pins skin_reset_and/Op2]
connect_bd_net [get_bd_pins overlap_release_constant/dout] [get_bd_pins core/overlap_release_toggle]
connect_bd_net [get_bd_pins pixel_clock/clk_out1] \
  [get_bd_pins rst_pixel/slowest_sync_clk] [get_bd_pins rgb2dvi/PixelClk] [get_bd_pins core/clk_pixel] \
  [get_bd_pins input_osd_0/pclk]
connect_bd_net [get_bd_pins pixel_clock/locked] [get_bd_pins rst_pixel/dcm_locked]
connect_bd_net [get_bd_pins ps7_0/FCLK_CLK0] \
  [get_bd_pins ps7_0/S_AXI_HP2_ACLK] [get_bd_pins hp2_smc/aclk] [get_bd_pins return_dma/s_axi_lite_aclk] \
  [get_bd_pins return_dma/m_axi_s2mm_aclk] [get_bd_pins return_control_gpio/s_axi_aclk] \
  [get_bd_pins return_start_gpio/s_axi_aclk] [get_bd_pins return_status_gpio/s_axi_aclk] \
  [get_bd_pins return_state_gpio/s_axi_aclk] [get_bd_pins core/aclk] [get_bd_pins input_osd_0/s_axi_aclk] \
  [get_bd_pins return_source/aclk] [get_bd_pins asset_generation_status_gpio/s_axi_aclk] \
  [get_bd_pins asset_packet_status_gpio/s_axi_aclk] [get_bd_pins asset_state_status_gpio/s_axi_aclk] \
  [get_bd_pins axi_dma/m_axi_mm2s_aclk] [get_bd_pins axi_dma/s_axi_lite_aclk] [get_bd_pins build_id_gpio/s_axi_aclk] \
  [get_bd_pins camera_hp1_smc/aclk] [get_bd_pins camera_iic/s_axi_aclk] [get_bd_pins capture_control/s_axi_aclk] \
  [get_bd_pins capture_source_fault/aclk] [get_bd_pins capture_status/s_axi_aclk] [get_bd_pins capture_write_pair/aclk] \
  [get_bd_pins command_read_address_gpio/s_axi_aclk] [get_bd_pins command_read_data_gpio/s_axi_aclk] \
  [get_bd_pins command_status_gpio/s_axi_aclk] [get_bd_pins demosaic/ap_clk] [get_bd_pins error_status_gpio/s_axi_aclk] \
  [get_bd_pins frame_dma/m_axi_s2mm_aclk] [get_bd_pins frame_dma/s_axi_lite_aclk] [get_bd_pins frame_dma/s_axis_s2mm_aclk] \
  [get_bd_pins framebuffer_status_gpio/s_axi_aclk] [get_bd_pins gp0_smc/aclk] [get_bd_pins hp0_smc/aclk] \
  [get_bd_pins moments_dma/m_axi_s2mm_aclk] [get_bd_pins moments_dma/m_axi_sg_aclk] [get_bd_pins moments_dma/s_axi_lite_aclk] \
  [get_bd_pins moments_reset/s_axi_aclk] [get_bd_pins packet_status_gpio/s_axi_aclk] [get_bd_pins packet_stream_width/aclk] \
  [get_bd_pins palette_generation_status_gpio/s_axi_aclk] [get_bd_pins palette_packet_status_gpio/s_axi_aclk] \
  [get_bd_pins palette_state_status_gpio/s_axi_aclk] [get_bd_pins pixel_clock/clk_in1] \
  [get_bd_pins present_completion_gpio/s_axi_aclk] [get_bd_pins ps7_0/M_AXI_GP0_ACLK] [get_bd_pins ps7_0/S_AXI_HP0_ACLK] \
  [get_bd_pins ps7_0/S_AXI_HP1_ACLK] [get_bd_pins ps7_0/S_AXI_HP3_ACLK] [get_bd_pins render_completion_gpio/s_axi_aclk] \
  [get_bd_pins render_cycles_gpio/s_axi_aclk] [get_bd_pins render_status_gpio/s_axi_aclk] \
  [get_bd_pins render_trace_gpio/s_axi_aclk] [get_bd_pins router_status_gpio/s_axi_aclk] \
  [get_bd_pins rst_fclk0/slowest_sync_clk] [get_bd_pins skin_hp3_smc/aclk] \
  [get_bd_pins tilemap_generation_status_gpio/s_axi_aclk] [get_bd_pins tilemap_packet_status_gpio/s_axi_aclk] \
  [get_bd_pins tilemap_state_status_gpio/s_axi_aclk] [get_bd_pins upload_status_gpio/s_axi_aclk] [get_bd_pins video_in/aclk] \
  [get_bd_pins vision_control_smc/aclk] [get_bd_pins vision_gp0_slice/aclk] [get_bd_pins dual_mask_capture/aclk] \
  [get_bd_pins capture_lifecycle/aclk] [get_bd_pins button_sync_0/aclk]
connect_bd_net [get_bd_pins ps7_0/FCLK_CLK1] [get_bd_ports vid_xclk]
connect_bd_net [get_bd_pins ps7_0/FCLK_RESET0_N] [get_bd_pins rst_fclk0/ext_reset_in] [get_bd_pins rst_pixel/ext_reset_in]
connect_bd_net [get_bd_pins return_control_gpio/gpio2_io_o] [get_bd_pins return_source/seed]
connect_bd_net [get_bd_pins return_control_gpio/gpio_io_o] [get_bd_pins return_source/requested_byte_count]
connect_bd_net [get_bd_pins return_dma/s2mm_introut] [get_bd_pins irq_concat/In1]
connect_bd_net [get_bd_pins return_source/busy] [get_bd_pins return_state_gpio/gpio_io_i]
connect_bd_net [get_bd_pins return_source/completed_byte_count] [get_bd_pins return_status_gpio/gpio_io_i]
connect_bd_net [get_bd_pins return_source/completed_packet_count] [get_bd_pins return_status_gpio/gpio2_io_i]
connect_bd_net [get_bd_pins return_source/rejected_start_count] [get_bd_pins return_state_gpio/gpio2_io_i]
connect_bd_net [get_bd_pins return_start_gpio/gpio_io_o] [get_bd_pins return_source/start]
connect_bd_net [get_bd_pins rgb2dvi/TMDS_Clk_n] [get_bd_ports hdmi_out_clk_n]
connect_bd_net [get_bd_pins rgb2dvi/TMDS_Clk_p] [get_bd_ports hdmi_out_clk_p]
connect_bd_net [get_bd_pins rgb2dvi/TMDS_Data_n] [get_bd_ports hdmi_out_data_n]
connect_bd_net [get_bd_pins rgb2dvi/TMDS_Data_p] [get_bd_ports hdmi_out_data_p]
connect_bd_net [get_bd_pins rst_fclk0/interconnect_aresetn] \
  [get_bd_pins gp0_smc/aresetn] [get_bd_pins hp0_smc/aresetn] [get_bd_pins hp2_smc/aresetn] \
  [get_bd_pins vision_control_smc/aresetn] [get_bd_pins camera_hp1_smc/aresetn] [get_bd_pins skin_hp3_smc/aresetn]
connect_bd_net [get_bd_pins rst_fclk0/peripheral_aresetn] \
  [get_bd_pins axi_dma/axi_resetn] [get_bd_pins build_id_gpio/s_axi_aresetn] [get_bd_pins upload_status_gpio/s_axi_aresetn] \
  [get_bd_pins packet_status_gpio/s_axi_aresetn] [get_bd_pins command_status_gpio/s_axi_aresetn] \
  [get_bd_pins error_status_gpio/s_axi_aresetn] [get_bd_pins command_read_address_gpio/s_axi_aresetn] \
  [get_bd_pins command_read_data_gpio/s_axi_aresetn] [get_bd_pins render_completion_gpio/s_axi_aresetn] \
  [get_bd_pins render_trace_gpio/s_axi_aresetn] [get_bd_pins render_cycles_gpio/s_axi_aresetn] \
  [get_bd_pins render_status_gpio/s_axi_aresetn] [get_bd_pins present_completion_gpio/s_axi_aresetn] \
  [get_bd_pins framebuffer_status_gpio/s_axi_aresetn] [get_bd_pins router_status_gpio/s_axi_aresetn] \
  [get_bd_pins palette_packet_status_gpio/s_axi_aresetn] [get_bd_pins palette_generation_status_gpio/s_axi_aresetn] \
  [get_bd_pins palette_state_status_gpio/s_axi_aresetn] [get_bd_pins asset_packet_status_gpio/s_axi_aresetn] \
  [get_bd_pins asset_generation_status_gpio/s_axi_aresetn] [get_bd_pins asset_state_status_gpio/s_axi_aresetn] \
  [get_bd_pins tilemap_packet_status_gpio/s_axi_aresetn] [get_bd_pins tilemap_generation_status_gpio/s_axi_aresetn] \
  [get_bd_pins tilemap_state_status_gpio/s_axi_aresetn] [get_bd_pins return_dma/axi_resetn] \
  [get_bd_pins return_control_gpio/s_axi_aresetn] [get_bd_pins return_start_gpio/s_axi_aresetn] \
  [get_bd_pins return_status_gpio/s_axi_aresetn] [get_bd_pins return_state_gpio/s_axi_aresetn] \
  [get_bd_pins vision_gp0_slice/aresetn] [get_bd_pins camera_iic/s_axi_aresetn] [get_bd_pins demosaic/ap_rst_n] \
  [get_bd_pins frame_dma/axi_resetn] [get_bd_pins moments_dma/axi_resetn] [get_bd_pins moments_reset/s_axi_aresetn] \
  [get_bd_pins video_in/aresetn] [get_bd_pins skin_reset_and/Op1] [get_bd_pins core/aresetn] \
  [get_bd_pins input_osd_0/s_axi_aresetn] [get_bd_pins return_source/aresetn] [get_bd_pins capture_control/common_aresetn] \
  [get_bd_pins capture_source_fault/common_aresetn] [get_bd_pins capture_write_pair/aresetn] \
  [get_bd_pins packet_stream_width/aresetn] [get_bd_pins capture_lifecycle/common_aresetn] \
  [get_bd_pins button_sync_0/aresetn]
connect_bd_net [get_bd_pins rst_fclk0/peripheral_reset] [get_bd_pins pixel_clock/reset]
connect_bd_net [get_bd_pins rst_pixel/peripheral_aresetn] [get_bd_pins core/resetn_pixel] [get_bd_pins input_osd_0/presetn]
connect_bd_net [get_bd_pins rst_pixel/peripheral_reset] [get_bd_pins rgb2dvi/aRst]
connect_bd_net [get_bd_pins skin_reset_and/Res] [get_bd_pins capture_control/s_axi_aresetn] [get_bd_pins capture_status/s_axi_aresetn]
connect_bd_net [get_bd_ports vid_data] [get_bd_pins video_in/vid_data]
connect_bd_net [get_bd_ports vid_hsync] [get_bd_pins video_in/vid_active_video] [get_bd_pins capture_lifecycle/vid_active_video]
connect_bd_net [get_bd_ports vid_pclk] \
  [get_bd_pins video_in/vid_io_in_clk] [get_bd_pins capture_source_fault/vid_io_in_clk] \
  [get_bd_pins capture_lifecycle/vid_io_in_clk]
connect_bd_net [get_bd_ports vid_vsync] [get_bd_pins video_in/vid_vsync] [get_bd_pins capture_lifecycle/vid_vsync]
connect_bd_net [get_bd_pins video_in/overflow] [get_bd_pins capture_source_fault/video_overflow] [get_bd_pins capture_lifecycle/video_overflow]
connect_bd_net [get_bd_pins video_in/underflow] [get_bd_pins capture_source_fault/aclk_underflow] [get_bd_pins capture_lifecycle/aclk_underflow]
connect_bd_net [get_bd_pins volume_zero/dout] [get_bd_pins irq_concat/In3]
set_property PFM.CLOCK {FCLK_CLK0 {id "0" is_default "true" proc_sys_reset "rst_fclk0" status "fixed"}} [get_bd_cells ps7_0]

# ---- address map ----
assign_bd_address -offset 0x00000000 -range 512M -target_address_space [get_bd_addr_spaces axi_dma/Data_MM2S] [get_bd_addr_segs ps7_0/S_AXI_HP0/HP0_DDR_LOWOCM]
assign_bd_address -offset 0x00000000 -range 512M -target_address_space [get_bd_addr_spaces frame_dma/Data_S2MM] [get_bd_addr_segs ps7_0/S_AXI_HP1/HP1_DDR_LOWOCM]
assign_bd_address -offset 0x00000000 -range 512M -target_address_space [get_bd_addr_spaces moments_dma/Data_MM2S] [get_bd_addr_segs ps7_0/S_AXI_HP3/HP3_DDR_LOWOCM]
assign_bd_address -offset 0x00000000 -range 512M -target_address_space [get_bd_addr_spaces moments_dma/Data_S2MM] [get_bd_addr_segs ps7_0/S_AXI_HP3/HP3_DDR_LOWOCM]
assign_bd_address -offset 0x00000000 -range 512M -target_address_space [get_bd_addr_spaces moments_dma/Data_SG] [get_bd_addr_segs ps7_0/S_AXI_HP3/HP3_DDR_LOWOCM]
assign_bd_address -offset 0x40400000 -range 64K -target_address_space [get_bd_addr_spaces ps7_0/Data] [get_bd_addr_segs axi_dma/S_AXI_LITE/Reg]
assign_bd_address -offset 0x40410000 -range 64K -target_address_space [get_bd_addr_spaces ps7_0/Data] [get_bd_addr_segs return_dma/S_AXI_LITE/Reg]
assign_bd_address -offset 0x40420000 -range 64K -target_address_space [get_bd_addr_spaces ps7_0/Data] [get_bd_addr_segs moments_dma/S_AXI_LITE/Reg]
assign_bd_address -offset 0x41200000 -range 64K -target_address_space [get_bd_addr_spaces ps7_0/Data] [get_bd_addr_segs build_id_gpio/S_AXI/Reg]
assign_bd_address -offset 0x41210000 -range 64K -target_address_space [get_bd_addr_spaces ps7_0/Data] [get_bd_addr_segs upload_status_gpio/S_AXI/Reg]
assign_bd_address -offset 0x41220000 -range 64K -target_address_space [get_bd_addr_spaces ps7_0/Data] [get_bd_addr_segs packet_status_gpio/S_AXI/Reg]
assign_bd_address -offset 0x41230000 -range 64K -target_address_space [get_bd_addr_spaces ps7_0/Data] [get_bd_addr_segs command_status_gpio/S_AXI/Reg]
assign_bd_address -offset 0x41240000 -range 64K -target_address_space [get_bd_addr_spaces ps7_0/Data] [get_bd_addr_segs error_status_gpio/S_AXI/Reg]
assign_bd_address -offset 0x41250000 -range 64K -target_address_space [get_bd_addr_spaces ps7_0/Data] [get_bd_addr_segs command_read_address_gpio/S_AXI/Reg]
assign_bd_address -offset 0x41260000 -range 64K -target_address_space [get_bd_addr_spaces ps7_0/Data] [get_bd_addr_segs command_read_data_gpio/S_AXI/Reg]
assign_bd_address -offset 0x41270000 -range 64K -target_address_space [get_bd_addr_spaces ps7_0/Data] [get_bd_addr_segs render_completion_gpio/S_AXI/Reg]
assign_bd_address -offset 0x41280000 -range 64K -target_address_space [get_bd_addr_spaces ps7_0/Data] [get_bd_addr_segs render_trace_gpio/S_AXI/Reg]
assign_bd_address -offset 0x41290000 -range 64K -target_address_space [get_bd_addr_spaces ps7_0/Data] [get_bd_addr_segs render_cycles_gpio/S_AXI/Reg]
assign_bd_address -offset 0x412A0000 -range 64K -target_address_space [get_bd_addr_spaces ps7_0/Data] [get_bd_addr_segs render_status_gpio/S_AXI/Reg]
assign_bd_address -offset 0x412B0000 -range 64K -target_address_space [get_bd_addr_spaces ps7_0/Data] [get_bd_addr_segs present_completion_gpio/S_AXI/Reg]
assign_bd_address -offset 0x412C0000 -range 64K -target_address_space [get_bd_addr_spaces ps7_0/Data] [get_bd_addr_segs framebuffer_status_gpio/S_AXI/Reg]
assign_bd_address -offset 0x412D0000 -range 64K -target_address_space [get_bd_addr_spaces ps7_0/Data] [get_bd_addr_segs router_status_gpio/S_AXI/Reg]
assign_bd_address -offset 0x412E0000 -range 64K -target_address_space [get_bd_addr_spaces ps7_0/Data] [get_bd_addr_segs palette_packet_status_gpio/S_AXI/Reg]
assign_bd_address -offset 0x412F0000 -range 64K -target_address_space [get_bd_addr_spaces ps7_0/Data] [get_bd_addr_segs palette_generation_status_gpio/S_AXI/Reg]
assign_bd_address -offset 0x41300000 -range 64K -target_address_space [get_bd_addr_spaces ps7_0/Data] [get_bd_addr_segs palette_state_status_gpio/S_AXI/Reg]
assign_bd_address -offset 0x41310000 -range 64K -target_address_space [get_bd_addr_spaces ps7_0/Data] [get_bd_addr_segs asset_packet_status_gpio/S_AXI/Reg]
assign_bd_address -offset 0x41320000 -range 64K -target_address_space [get_bd_addr_spaces ps7_0/Data] [get_bd_addr_segs asset_generation_status_gpio/S_AXI/Reg]
assign_bd_address -offset 0x41330000 -range 64K -target_address_space [get_bd_addr_spaces ps7_0/Data] [get_bd_addr_segs asset_state_status_gpio/S_AXI/Reg]
assign_bd_address -offset 0x41340000 -range 64K -target_address_space [get_bd_addr_spaces ps7_0/Data] [get_bd_addr_segs tilemap_packet_status_gpio/S_AXI/Reg]
assign_bd_address -offset 0x41350000 -range 64K -target_address_space [get_bd_addr_spaces ps7_0/Data] [get_bd_addr_segs tilemap_generation_status_gpio/S_AXI/Reg]
assign_bd_address -offset 0x41360000 -range 64K -target_address_space [get_bd_addr_spaces ps7_0/Data] [get_bd_addr_segs tilemap_state_status_gpio/S_AXI/Reg]
assign_bd_address -offset 0x41380000 -range 64K -target_address_space [get_bd_addr_spaces ps7_0/Data] [get_bd_addr_segs return_control_gpio/S_AXI/Reg]
assign_bd_address -offset 0x41390000 -range 64K -target_address_space [get_bd_addr_spaces ps7_0/Data] [get_bd_addr_segs return_start_gpio/S_AXI/Reg]
assign_bd_address -offset 0x413A0000 -range 64K -target_address_space [get_bd_addr_spaces ps7_0/Data] [get_bd_addr_segs return_status_gpio/S_AXI/Reg]
assign_bd_address -offset 0x413B0000 -range 64K -target_address_space [get_bd_addr_spaces ps7_0/Data] [get_bd_addr_segs return_state_gpio/S_AXI/Reg]
assign_bd_address -offset 0x413D0000 -range 64K -target_address_space [get_bd_addr_spaces ps7_0/Data] [get_bd_addr_segs moments_reset/S_AXI/Reg]
assign_bd_address -offset 0x413F0000 -range 64K -target_address_space [get_bd_addr_spaces ps7_0/Data] [get_bd_addr_segs capture_control/s_axi/reg0]
assign_bd_address -offset 0x41410000 -range 64K -target_address_space [get_bd_addr_spaces ps7_0/Data] [get_bd_addr_segs capture_status/s_axi/reg0]
assign_bd_address -offset 0x41600000 -range 64K -target_address_space [get_bd_addr_spaces ps7_0/Data] [get_bd_addr_segs camera_iic/S_AXI/Reg]
assign_bd_address -offset 0x43000000 -range 64K -target_address_space [get_bd_addr_spaces ps7_0/Data] [get_bd_addr_segs frame_dma/S_AXI_LITE/Reg]
assign_bd_address -offset 0x43C00000 -range 64K -target_address_space [get_bd_addr_spaces ps7_0/Data] [get_bd_addr_segs demosaic/s_axi_CTRL/Reg]
assign_bd_address -offset 0x43C20000 -range 4K -target_address_space [get_bd_addr_spaces ps7_0/Data] [get_bd_addr_segs input_osd_0/S_AXI/reg0]
assign_bd_address -offset 0x00000000 -range 512M -target_address_space [get_bd_addr_spaces return_dma/Data_S2MM] [get_bd_addr_segs ps7_0/S_AXI_HP2/HP2_DDR_LOWOCM]

validate_bd_design
save_bd_design
